# EasyEDA Pro project ran-pang-airlink-86231b34.epro, board PCB1
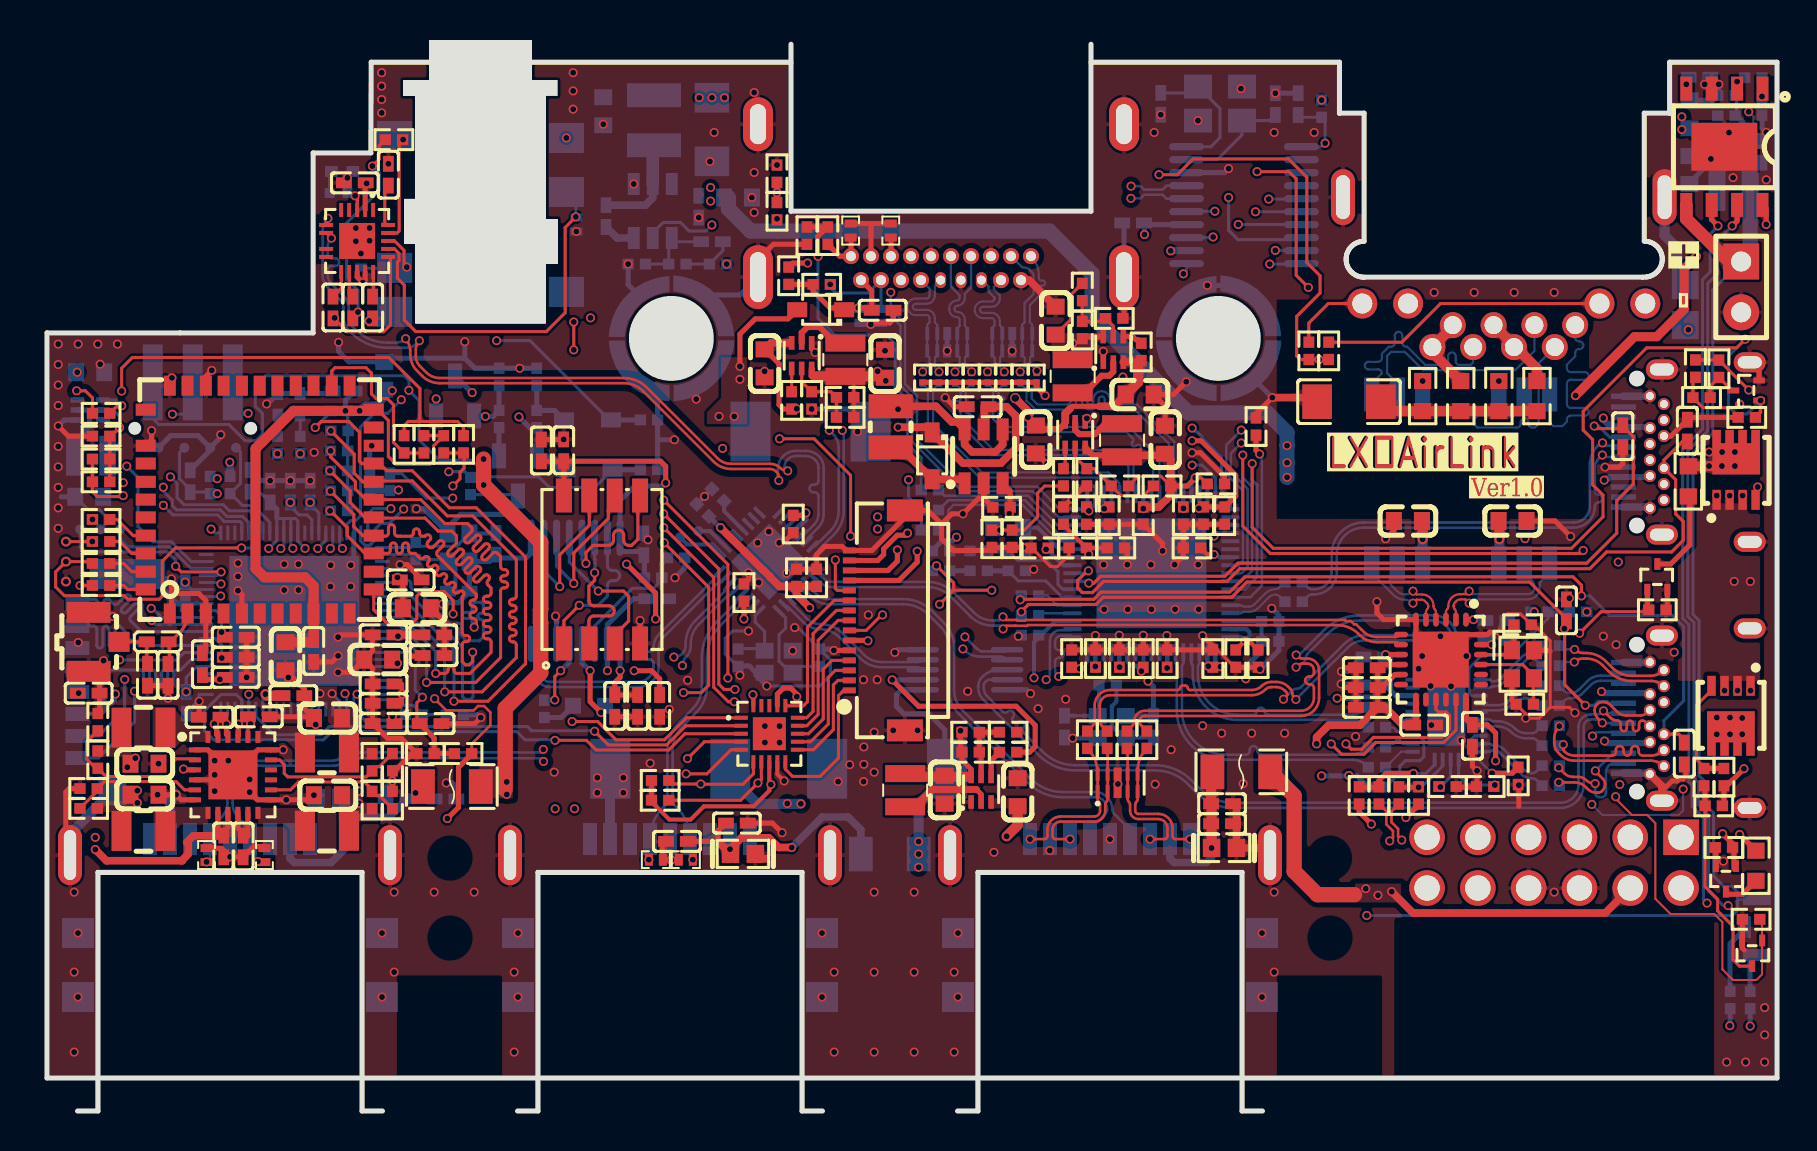
[diagram p9: board, top side]
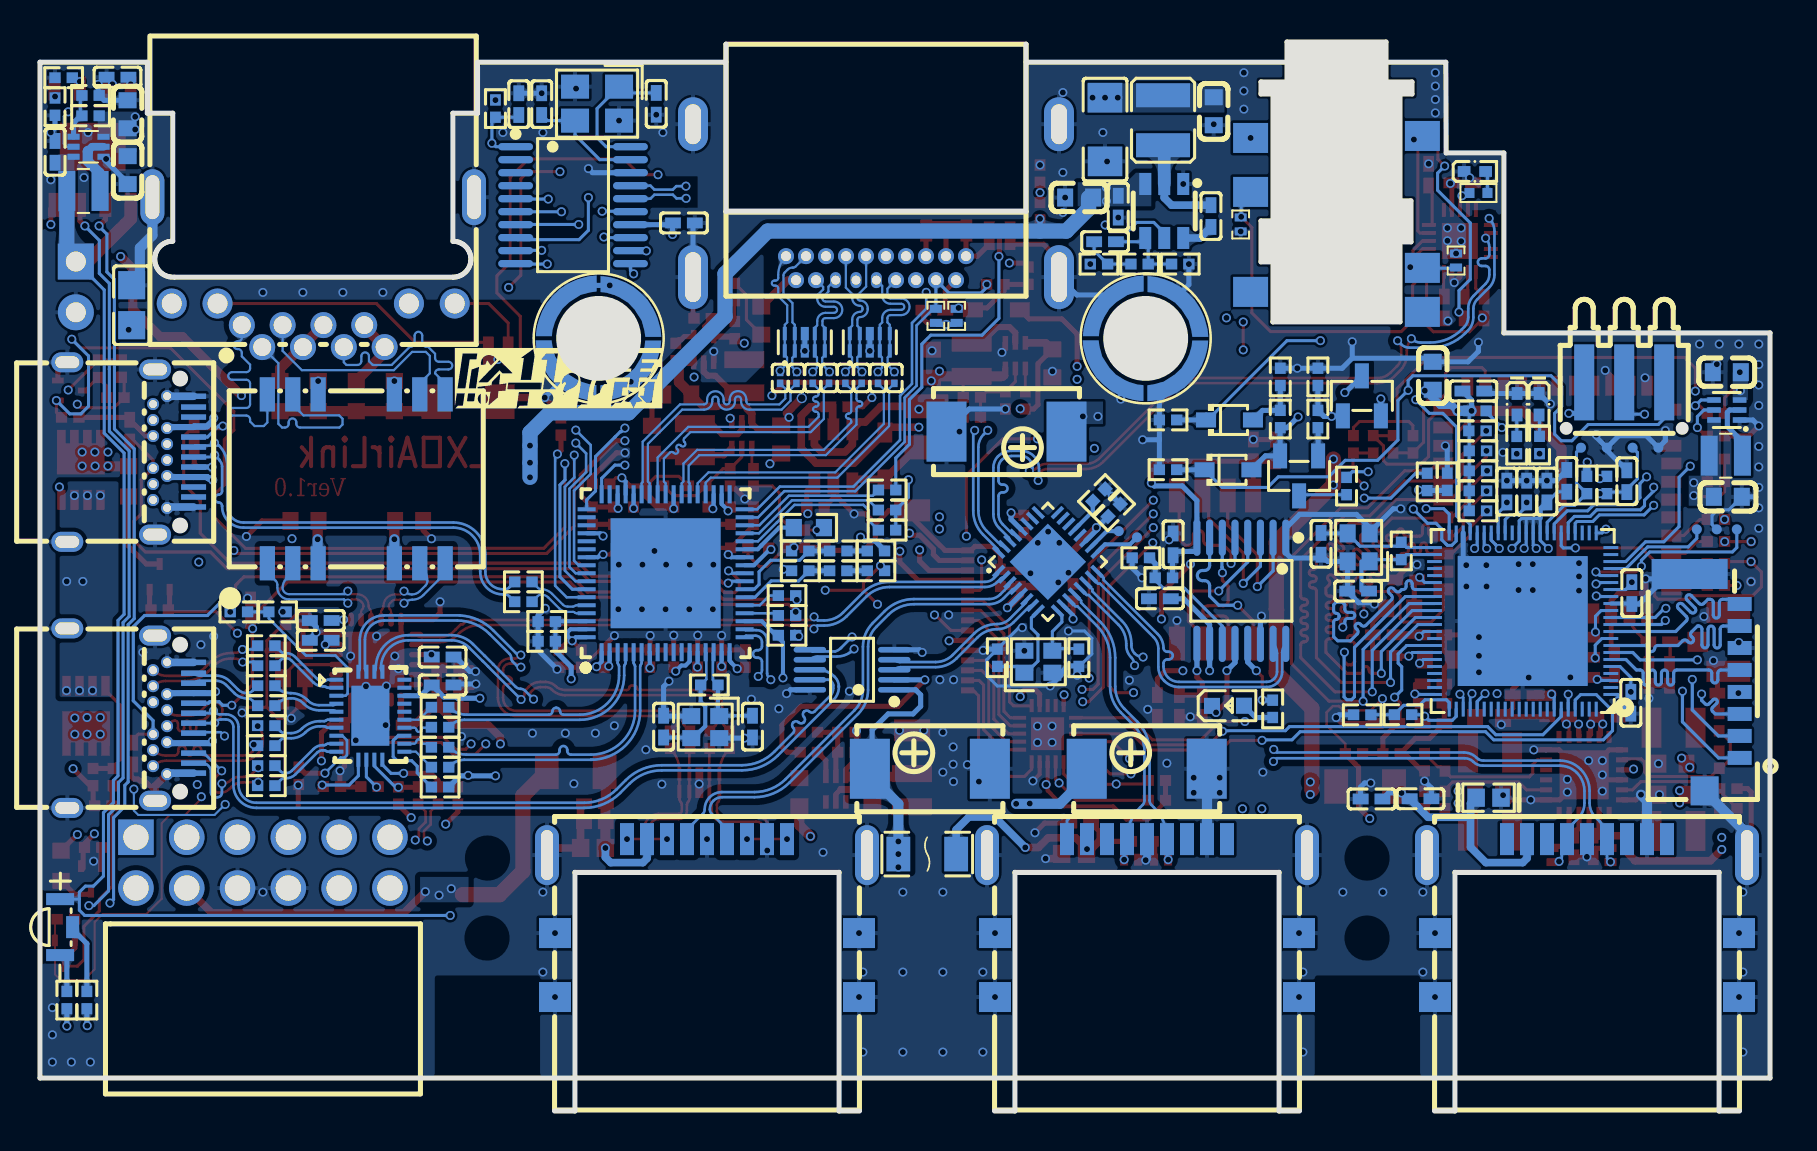
[diagram p10: board, bottom side, seen from below]

Outline 86.5 x 53.58 mm; copper layers: Top Layer, Inner2, Inner3, Inner4, Inner5, Bottom Layer. Coordinates in mm from the lower left corner of the outline.
Outline path: 37.2,52.46 16.21,52.46 16.19,47.93 13.31,47.93 13.31,38.92 0,38.92 0,1.65 86.5,1.65 86.5,52.46 81.13,52.46 81.13,49.91 ; 52.2,52.46 64.62,52.46 64.62,49.91
Stack: Top Layer 0.035mm 外层铜厚1oz / Dielectric1 0.0994mm 3313 RC57% 4.2mil / Inner2 0.0152mm 内层铜厚 / Dielectric2 0.55mm 0.55mm H/H No copper / Inner3 0.0152mm 内层铜厚 / Dielectric3 0.1088mm 2116 RC54% 4.9mil / Inner4 0.0152mm 内层铜厚 / Dielectric4 0.55mm 0.55mm H/H No copper / Inner5 0.0152mm 内层铜厚 / Dielectric5 0.0994mm 3313 RC57% 4.2mil / Bottom Layer 0.035mm 外层铜厚1oz

## Design rules (mm)
net SSTX1-: SSTX1
net SSTX1+: SSTX1
net SSTX2-: SSTX2
net SSTX2+: SSTX2
net SSTX3-: SSTX3
net SSTX3+: SSTX3
net SSTX0+: diff, SSTX0
net SSTX0-: diff, SSTX0
net SSTX4-: SSTX4
net SSTX4+: SSTX4
net HSD4-: HSD4
net HSD4+: HSD4
net AU_D-: diff, AU_D
net AU_D+: diff, AU_D
net HDMI_D2D_P: diff, HDMI_D2D_
net HDMI_D2D_N: diff, HDMI_D2D_
net HDMI_D1D_P: diff, HDMI_D1D_
net HDMI_D1D_N: diff, HDMI_D1D_
net HDMI_D0D_P: diff, HDMI_D0D_
net HDMI_D0D_N: diff, HDMI_D0D_
net HDMI_CKD_P: diff, HDMI_CKD_
net HDMI_CKD_N: diff, HDMI_CKD_
net SSRX1-: SSRX1
net SSRX1+: SSRX1
net SSRX2-: SSRX2
net SSRX2+: SSRX2
net SOC_OTG_DP: diff, SOC_OTG
net SOC_OTG_DM: diff, SOC_OTG
net HSD1+: HSD1
net HSD1-: HSD1
net USBA_D4-: USBA_D4
net USBA_D4+: USBA_D4
net SSRX0+: diff, SSRX0
net SSRX0-: diff, SSRX0
net HSD0+: diff, HSD0
net HSD0-: diff, HSD0
net EPHY_RXN: diff, EPHY_RX
net EPHY_RXP: diff, EPHY_RX
net EPHY_TXN: diff, EPHY_TX
net EPHY_TXP: diff, EPHY_TX
net SSRX4-: SSRX4
net SSRX4+: SSRX4
net SSRX3-: SSRX3
net SSRX3+: SSRX3
net HSD3-: HSD3
net HSD3+: HSD3
net HSD2-: HSD2
net HSD2+: HSD2
net HDMI-5V: diff
net C_SSRX2-: diff, C_SSRX2
net C_SSRX2+: diff, C_SSRX2
net C_SSTX2-: diff, C_SSTX2
net C_SSTX2+: diff, C_SSTX2
net C_SSTX1-: diff, C_SSTX1
net C_SSTX1+: diff, C_SSTX1
net C_SSRX1-: diff, C_SSRX1
net C_SSRX1+: diff, C_SSRX1
net DP_LANE1+: diff, DP_LANE1
net DP_LANE1-: diff, DP_LANE1
net LNB_P: diff, LNB_
net LNB_N: diff, LNB_
net DP_LANE0+: diff, DP_LANE0
net DP_LANE0-: diff, DP_LANE0
net LNA_P: diff, LNA_
net LNA_N: diff, LNA_
net UFP_AUX_N: diff, UFP_AUX_
net UFP_AUX_P: diff, UFP_AUX_
net HDMI_D2P: diff, HDMI_D2
net HDMI_D2N: diff, HDMI_D2
net HDMI_D1P: diff, HDMI_D1
net HDMI_D1N: diff, HDMI_D1
net HDMI_D0P: diff, HDMI_D0
net HDMI_D0N: diff, HDMI_D0
net HDMI_CKP: diff, HDMI_CK
net HDMI_CKN: diff, HDMI_CK
net BB_DP: diff, BB_D
net BB_DN: diff, BB_D
net USBA_D3-: diff, USBA_D3
net USBA_D3+: diff, USBA_D3
net RX2-: diff, RX2
net RX2+: diff, RX2
net TX2-: diff, TX2
net TX2+: diff, TX2
net TX1-: diff, TX1
net TX1+: diff, TX1
net RX1-: diff, RX1
net RX1+: diff, RX1
net VL822_TX1+: VL822_TX1
net VL822_TX1-: VL822_TX1
net VL822_TX2+: VL822_TX2
net VL822_TX2-: VL822_TX2
net VL822_TX3+: VL822_TX3
net VL822_TX3-: VL822_TX3
net VL822_TX4+: VL822_TX4
net VL822_TX4-: VL822_TX4
net CH347_UD-: diff, CH347_UD
net CH347_UD+: diff, CH347_UD
net MIC_N: diff
net MIC_P: diff
net MIC_M: diff
net USBA_D2+: diff, DP1
net USBA_D2-: diff, DP1
net USBA_D1+: diff, USBA_D1
net USBA_D1-: diff, USBA_D1
net DD-: DD
net DD+: DD
net DC-: DC
net DC+: DC
net DB-: diff, DB
net DB+: diff, DB
net DA-: diff, DA
net DA+: diff, DA
net TXN: diff, DP5
net TXP: diff, DP5
net RXN: diff, DP4
net RXP: diff, DP4
net NAT_D-: diff, NAT_D
net NAT_D+: diff, NAT_D
net POWUSB_DP: diff, DP6
net POWUSB_DN: diff, DP6
net SD_DM: diff, DP3
net SD_DP: diff, DP3
net HUB_D+: diff, DP2
net HUB_D-: diff, DP2
net #SSTX0+: diff, #SSTX0
net #SSTX0-: diff, #SSTX0
net #SSRX0+: diff, #SSRX0
net #SSRX0-: diff, #SSRX0
spacing copperThickness1oz (default): track to track 0.102, other pairs 0.114 to 0.3
spacing copperThickness2oz: track to track 0.203, other pairs 0.152 to 0.3
spacing safeClearance: track to track 0.089, other pairs 0.089 to 0.3
spacing Plane_innerPlane: track to track 0.102, other pairs 0.114 to 0.3
spacing Copper_copperRegion: track to track 0.102, other pairs 0.114 to 0.3
spacing Copper_DRAMCopper: track to track 0.102, other pairs 0.114 to 0.3
spacing Copper_TBCopper: track to track 0.102, other pairs 0.114 to 0.3
spacing Copper_copperRegion_POW: track to track 0.102, other pairs 0.114 to 0.3
spacing diff-to-gnd: track to track 0.152, other pairs 0.152 to 0.3
track width copperThickness1oz (default): min 0.102, default 0.254, max 2.54
track width copperThickness2oz: min 0.203, default 0.254, max 2.54
track width trackWidth: min 0.089, default 0.102, max 2.54
track width 50ohm: min 0.127, default 0.157, max 2.54
differential pair differentialPair (default): width min 0.102, default 0.254, max 2.54; gap min 0.102, default 0.102
differential pair DP100ohm: width min 0.102, default 0.109, max 2.54; gap min 0.152, default 0.152
differential pair DP90ohm: width min 0.13, default 0.13, max 0.13; gap min 0.127, default 0.127
net SSTX0+ uses DP90ohm
net SSTX0- uses DP90ohm
net AU_D- uses DP90ohm
net AU_D+ uses DP90ohm
net VIN_5V uses copperRegion_POW_copperThickness1oz
net HDMI_D2D_P uses DP100ohm
net HDMI_D2D_N uses DP100ohm
net HDMI_D1D_P uses DP100ohm
net HDMI_D1D_N uses DP100ohm
net HDMI_D0D_P uses DP100ohm
net HDMI_D0D_N uses DP100ohm
net HDMI_CKD_P uses DP100ohm
net HDMI_CKD_N uses DP100ohm
net SOC_OTG_DP uses DP90ohm
net SOC_OTG_DM uses DP90ohm
net USBA_D4- uses DP90ohm
net USBA_D4+ uses DP90ohm
net SSRX0+ uses DP90ohm
net SSRX0- uses DP90ohm
net HSD0+ uses DP90ohm
net HSD0- uses DP90ohm
net SD0_D1 uses 50ohm
net SD0_D0 uses 50ohm
net SD0_CLK uses 50ohm
net SD0_CMD uses 50ohm
net SD0_D3 uses 50ohm
net SD0_D2 uses 50ohm
net SD1_D2 uses 50ohm
net SD1_D3 uses 50ohm
net SD1_CMD uses 50ohm
net SD1_CLK uses 50ohm
net SD1_D0 uses 50ohm
net SD1_D1 uses 50ohm
net EPHY_RXN uses DP100ohm
net EPHY_RXP uses DP100ohm
net EPHY_TXN uses DP100ohm
net EPHY_TXP uses DP100ohm
net MIPI_RX4N uses DP100ohm
net MIPI_RX4P uses DP100ohm
net MIPI_RX3N uses DP100ohm
net MIPI_RX3P uses DP100ohm
net MIPI_RX2N uses DP100ohm
net MIPI_RX2P uses DP100ohm
net MIPI_RX1N uses DP100ohm
net MIPI_RX1P uses DP100ohm
net MIPI_RX0N uses DP100ohm
net MIPI_RX0P uses DP100ohm
net MIPI_TX2N uses DP100ohm
net MIPI_TX2P uses DP100ohm
net MIPI_TX1N uses DP100ohm
net MIPI_TX1P uses DP100ohm
net MIPI_TX0N uses DP100ohm
net MIPI_TX0P uses DP100ohm
net 5V-20V uses copperRegion1_copperThickness1oz
net C_SSRX2- uses DP90ohm
net C_SSRX2+ uses DP90ohm
net C_SSTX2- uses DP90ohm
net C_SSTX2+ uses DP90ohm
net C_SSTX1- uses DP90ohm
net C_SSTX1+ uses DP90ohm
net C_SSRX1- uses DP90ohm
net C_SSRX1+ uses DP90ohm
net DP_LANE1+ uses DP90ohm
net DP_LANE1- uses DP90ohm
net LNB_P uses DP100ohm
net LNB_N uses DP100ohm
net DP_LANE0+ uses DP90ohm
net DP_LANE0- uses DP90ohm
net LNA_P uses DP100ohm
net LNA_N uses DP100ohm
net UFP_AUX_N uses DP90ohm
net UFP_AUX_P uses DP90ohm
net HDMI_D2P uses DP100ohm
net HDMI_D2N uses DP100ohm
net HDMI_D1P uses DP100ohm
net HDMI_D1N uses DP100ohm
net HDMI_D0P uses DP100ohm
net HDMI_D0N uses DP100ohm
net HDMI_CKP uses DP100ohm
net HDMI_CKN uses DP100ohm
net MDI0P uses DP100ohm
net MDI0N uses DP100ohm
net MDI1P uses DP100ohm
net MDI1N uses DP100ohm
net MDI2P uses DP100ohm
net MDI2N uses DP100ohm
net MDI3P uses DP100ohm
net MDI3N uses DP100ohm
net BB_DP uses DP100ohm
net BB_DN uses DP100ohm
net USBA_D3- uses DP90ohm
net USBA_D3+ uses DP90ohm
net USB3.0_TO_USB2.0HUB_DM uses DP90ohm
net USB3.0_TO_USB2.0HUB_DP uses DP90ohm
net RX2- uses DP90ohm
net RX2+ uses DP90ohm
net TX2- uses DP90ohm
net TX2+ uses DP90ohm
net TX1- uses DP90ohm
net TX1+ uses DP90ohm
net RX1- uses DP90ohm
net RX1+ uses DP90ohm
diff pair SSTX0 uses DP90ohm
diff pair AU_D uses DP90ohm
diff pair HDMI_D2D_ uses DP100ohm
diff pair HDMI_D1D_ uses DP100ohm
diff pair HDMI_D0D_ uses DP100ohm
diff pair HDMI_CKD_ uses DP100ohm
diff pair SOC_OTG uses DP90ohm
diff pair USBA_D4 uses DP90ohm
diff pair SSRX0 uses DP90ohm
diff pair HSD0 uses DP90ohm
diff pair EPHY_RX uses DP100ohm
diff pair EPHY_TX uses DP100ohm
diff pair C_SSRX2 uses DP90ohm
diff pair C_SSTX2 uses DP90ohm
diff pair C_SSTX1 uses DP90ohm
diff pair C_SSRX1 uses DP90ohm
diff pair DP_LANE1 uses DP90ohm
diff pair LNB_ uses DP100ohm
diff pair DP_LANE0 uses DP90ohm
diff pair LNA_ uses DP100ohm
diff pair UFP_AUX_ uses DP90ohm
diff pair HDMI_D2 uses DP100ohm
diff pair HDMI_D1 uses DP100ohm
diff pair HDMI_D0 uses DP100ohm
diff pair HDMI_CK uses DP100ohm
diff pair BB_D uses DP100ohm
diff pair DP2 uses DP90ohm
diff pair USBA_D3 uses DP90ohm
diff pair DP1 uses DP90ohm
diff pair RX2 uses DP90ohm
diff pair TX2 uses DP90ohm
diff pair TX1 uses DP90ohm
diff pair RX1 uses DP90ohm
eq len grp WIFI_SDIO uses WL-SDIO
eq len grp LPDDR3_CLK_CTL_CMD uses LPDDR3_CLK_CTL_CMD
eq len grp LPDDR3_SDQ8-15 uses LPDDR3_SDQ8-15
eq len grp LPDDR3_SDQ0-7 uses LPDDR3_SDQ0-7
region e1 uses Copper_copperRegion, copperRegion_Copper_copperRegion
region e2 uses Copper_copperRegion, copperRegion_Copper_copperRegion
region e3 uses Copper_copperRegion, copperRegion_Copper_copperRegion
region e4 uses Copper_copperRegion, copperRegion_Copper_copperRegion
region e5 uses Copper_copperRegion, copperRegion_Copper_copperRegion
region e6 uses Copper_copperRegion, copperRegion_Copper_copperRegion
region e7 uses Copper_copperRegion, copperRegion_Copper_copperRegion
region e8 uses Copper_copperRegion, copperRegion_Copper_copperRegion
region e9 uses Copper_copperRegion, copperRegion_Copper_copperRegion
region e10 uses Copper_copperRegion, copperRegion_Copper_copperRegion
region e11 uses Copper_copperRegion, copperRegion_Copper_copperRegion
region e12 uses Copper_copperRegion, copperRegion_Copper_copperRegion
region e13 uses Copper_copperRegion, copperRegion_Copper_copperRegion
region e14 uses Copper_copperRegion, copperRegion_Copper_copperRegion
region e15 uses Copper_copperRegion, copperRegion_Copper_copperRegion
region e16 uses Copper_copperRegion, copperRegion_Copper_copperRegion
region e17 uses Copper_copperRegion, copperRegion_Copper_copperRegion
region e18 uses Copper_copperRegion, copperRegion_Copper_copperRegion
region e19 uses Copper_copperRegion, copperRegion_Copper_copperRegion
region e20 uses Copper_copperRegion, copperRegion_Copper_copperRegion
region e21 uses Copper_copperRegion, copperRegion_Copper_copperRegion
region e22 uses Copper_copperRegion, copperRegion_Copper_copperRegion
region e23 uses Copper_copperRegion, copperRegion_Copper_copperRegion
region e24 uses Copper_copperRegion, copperRegion_Copper_copperRegion
region e25 uses Copper_copperRegion, copperRegion_Copper_copperRegion
region e26 uses Copper_copperRegion, copperRegion_Copper_copperRegion
region e27 uses Copper_copperRegion, copperRegion_Copper_copperRegion
region e28 uses Copper_copperRegion, copperRegion_Copper_copperRegion
region e29 uses Copper_copperRegion, copperRegion_Copper_copperRegion
region e30 uses Copper_copperRegion, copperRegion_Copper_copperRegion
region e31 uses Copper_copperRegion, copperRegion_Copper_copperRegion
region e32 uses Copper_copperRegion, copperRegion_Copper_copperRegion
region e33 uses Copper_copperRegion, copperRegion_Copper_copperRegion
region e34 uses Copper_copperRegion, copperRegion_Copper_copperRegion
region e35 uses Copper_copperRegion, copperRegion_Copper_copperRegion
region e36 uses Copper_copperRegion, copperRegion_Copper_copperRegion
region e37 uses Copper_copperRegion, copperRegion_Copper_copperRegion
region e38 uses Copper_copperRegion, copperRegion_Copper_copperRegion
region e39 uses Copper_copperRegion, copperRegion_Copper_copperRegion
region e40 uses Copper_copperRegion, copperRegion_Copper_copperRegion
region e41 uses Copper_copperRegion, copperRegion_Copper_copperRegion
region e42 uses Copper_copperRegion, copperRegion_Copper_copperRegion
region e43 uses Copper_copperRegion, copperRegion_Copper_copperRegion
region e44 uses Copper_copperRegion, copperRegion_Copper_copperRegion
region e45 uses Copper_copperRegion, copperRegion_Copper_copperRegion
region e46 uses Copper_copperRegion, copperRegion_Copper_copperRegion
region e47 uses Copper_copperRegion, copperRegion_Copper_copperRegion
region e48 uses Copper_copperRegion, copperRegion_Copper_copperRegion
region e49 uses Copper_copperRegion, copperRegion_Copper_copperRegion
region e50 uses Copper_copperRegion, copperRegion_Copper_copperRegion
region e51 uses Copper_copperRegion, copperRegion_Copper_copperRegion
region e52 uses Copper_copperRegion, copperRegion_Copper_copperRegion
region e53 uses Copper_copperRegion, copperRegion_Copper_copperRegion
region e54 uses Copper_copperRegion, copperRegion_Copper_copperRegion
region e55 uses Copper_copperRegion, copperRegion_Copper_copperRegion
region e56 uses Copper_copperRegion, copperRegion_Copper_copperRegion
region e57 uses Copper_copperRegion, copperRegion_Copper_copperRegion
region e58 uses Copper_copperRegion, copperRegion_Copper_copperRegion
region e59 uses Copper_copperRegion, copperRegion_Copper_copperRegion
region e60 uses Copper_copperRegion, copperRegion_Copper_copperRegion
region e61 uses Copper_copperRegion, copperRegion_Copper_copperRegion
region e62 uses Copper_copperRegion, copperRegion_Copper_copperRegion
region e63 uses Copper_copperRegion, copperRegion_Copper_copperRegion
region e64 uses Copper_copperRegion, copperRegion_Copper_copperRegion
region e65 uses Copper_copperRegion, copperRegion_Copper_copperRegion
region e66 uses Copper_copperRegion, copperRegion_Copper_copperRegion
region e67 uses Copper_copperRegion, copperRegion_Copper_copperRegion
region e68 uses Copper_copperRegion, copperRegion_Copper_copperRegion
region e69 uses Copper_copperRegion, copperRegion_Copper_copperRegion
region e70 uses Copper_copperRegion, copperRegion_Copper_copperRegion
region e71 uses Copper_copperRegion, copperRegion_Copper_copperRegion
region e72 uses Copper_copperRegion, copperRegion_Copper_copperRegion
region e73 uses Copper_copperRegion, copperRegion_Copper_copperRegion
region e74 uses Copper_copperRegion, copperRegion_Copper_copperRegion
region e75 uses Copper_copperRegion, copperRegion_Copper_copperRegion
region e76 uses Copper_copperRegion, copperRegion_Copper_copperRegion
region e77 uses Copper_copperRegion, copperRegion_Copper_copperRegion
region e78 uses Copper_copperRegion, copperRegion_Copper_copperRegion
region e79 uses Copper_copperRegion, copperRegion_Copper_copperRegion
region e80 uses Copper_copperRegion, copperRegion_Copper_copperRegion
region e81 uses Copper_copperRegion, copperRegion_Copper_copperRegion
region e82 uses Copper_copperRegion, copperRegion_Copper_copperRegion
region e83 uses Copper_copperRegion, copperRegion_Copper_copperRegion
region e84 uses Copper_copperRegion, copperRegion_Copper_copperRegion
region e85 uses Copper_copperRegion, copperRegion_Copper_copperRegion
region e86 uses Copper_copperRegion, copperRegion_Copper_copperRegion
region e87 uses Copper_copperRegion, copperRegion_Copper_copperRegion
region e88 uses Copper_copperRegion, copperRegion_Copper_copperRegion
region e89 uses Copper_copperRegion, copperRegion_Copper_copperRegion
region e90 uses Copper_copperRegion, copperRegion_Copper_copperRegion
region e91 uses Copper_copperRegion, copperRegion_Copper_copperRegion
region e92 uses Copper_copperRegion, copperRegion_Copper_copperRegion
region e93 uses Copper_copperRegion, copperRegion_Copper_copperRegion
region e94 uses Copper_copperRegion, copperRegion_Copper_copperRegion
region e95 uses Copper_copperRegion, copperRegion_Copper_copperRegion
region e96 uses Copper_copperRegion, copperRegion_Copper_copperRegion
region e97 uses Copper_copperRegion, copperRegion_Copper_copperRegion
region e98 uses Copper_copperRegion, copperRegion_Copper_copperRegion
region e100 uses Copper_copperRegion, copperRegion_Copper_copperRegion
region e101 uses Copper_copperRegion, copperRegion_Copper_copperRegion
region e102 uses Copper_copperRegion, copperRegion_Copper_copperRegion
region e103 uses Copper_copperRegion, copperRegion_Copper_copperRegion
region e104 uses Copper_copperRegion, copperRegion_Copper_copperRegion
region e105 uses Copper_copperRegion, copperRegion_Copper_copperRegion
region e106 uses Copper_copperRegion, copperRegion_Copper_copperRegion
region e107 uses Copper_copperRegion, copperRegion_Copper_copperRegion
region e108 uses Copper_copperRegion, copperRegion_Copper_copperRegion
region e109 uses Copper_copperRegion, copperRegion_Copper_copperRegion
region e110 uses Copper_copperRegion, copperRegion_Copper_copperRegion
region e111 uses Copper_copperRegion, copperRegion_Copper_copperRegion
region e112 uses Copper_copperRegion, copperRegion_Copper_copperRegion
region e113 uses Copper_copperRegion, copperRegion_Copper_copperRegion
region e114 uses Copper_copperRegion, copperRegion_Copper_copperRegion
region e115 uses Copper_copperRegion, copperRegion_Copper_copperRegion
region e116 uses Copper_copperRegion, copperRegion_Copper_copperRegion
region e117 uses Copper_copperRegion, copperRegion_Copper_copperRegion
region e118 uses Copper_copperRegion, copperRegion_Copper_copperRegion
region e119 uses Copper_copperRegion, copperRegion_Copper_copperRegion
region e120 uses Copper_copperRegion, copperRegion_Copper_copperRegion
region e121 uses Copper_copperRegion, copperRegion_Copper_copperRegion
region e122 uses Copper_copperRegion, copperRegion_Copper_copperRegion
region e123 uses Copper_copperRegion, copperRegion_Copper_copperRegion
region e124 uses Copper_copperRegion, copperRegion_Copper_copperRegion
region e125 uses Copper_copperRegion, copperRegion_Copper_copperRegion
region e126 uses Copper_copperRegion, copperRegion_Copper_copperRegion
region e127 uses Copper_copperRegion, copperRegion_Copper_copperRegion
region e128 uses Copper_copperRegion, copperRegion_Copper_copperRegion
region e129 uses Copper_copperRegion, copperRegion_Copper_copperRegion
region e130 uses Copper_copperRegion, copperRegion_Copper_copperRegion
region e131 uses Copper_copperRegion, copperRegion_Copper_copperRegion
region e132 uses Copper_copperRegion, copperRegion_Copper_copperRegion
region e133 uses Copper_copperRegion, copperRegion_Copper_copperRegion
region e134 uses Copper_copperRegion, copperRegion_Copper_copperRegion
region e135 uses Copper_copperRegion, copperRegion_Copper_copperRegion
region e136 uses Copper_copperRegion, copperRegion_Copper_copperRegion
region e137 uses Copper_copperRegion, copperRegion_Copper_copperRegion
region e138 uses Copper_copperRegion, copperRegion_Copper_copperRegion
region e139 uses Copper_copperRegion, copperRegion_Copper_copperRegion
region e140 uses Copper_copperRegion, copperRegion_Copper_copperRegion
region e141 uses Copper_copperRegion, copperRegion_Copper_copperRegion
region e142 uses Copper_copperRegion, copperRegion_Copper_copperRegion
region e143 uses Copper_copperRegion, copperRegion_Copper_copperRegion
region e144 uses Copper_copperRegion, copperRegion_Copper_copperRegion
region e145 uses Copper_copperRegion, copperRegion_Copper_copperRegion
region e146 uses Copper_copperRegion, copperRegion_Copper_copperRegion
region e147 uses Copper_copperRegion, copperRegion_Copper_copperRegion
region e148 uses Copper_copperRegion, copperRegion_Copper_copperRegion
region e149 uses Copper_copperRegion, copperRegion_Copper_copperRegion
region e150 uses Copper_copperRegion, copperRegion_Copper_copperRegion
region e151 uses Copper_copperRegion, copperRegion_Copper_copperRegion
region e152 uses Copper_copperRegion, copperRegion_Copper_copperRegion
region e153 uses Copper_copperRegion, copperRegion_Copper_copperRegion
region e154 uses Copper_copperRegion, copperRegion_Copper_copperRegion
region e155 uses Copper_copperRegion, copperRegion_Copper_copperRegion
region e156 uses Copper_copperRegion, copperRegion_Copper_copperRegion
region e157 uses Copper_copperRegion, copperRegion_Copper_copperRegion
region e158 uses Copper_copperRegion, copperRegion_Copper_copperRegion
region e159 uses Copper_copperRegion, copperRegion_Copper_copperRegion
region e160 uses Copper_copperRegion, copperRegion_Copper_copperRegion
region e161 uses Copper_copperRegion, copperRegion_Copper_copperRegion
region e162 uses Copper_copperRegion, copperRegion_Copper_copperRegion
region e163 uses Copper_copperRegion, copperRegion_Copper_copperRegion
region e164 uses Copper_copperRegion, copperRegion_Copper_copperRegion
region e165 uses Copper_copperRegion, copperRegion_Copper_copperRegion
region e166 uses Copper_copperRegion, copperRegion_Copper_copperRegion
region e167 uses Copper_copperRegion, copperRegion_Copper_copperRegion
region e168 uses Copper_copperRegion, copperRegion_Copper_copperRegion
region e169 uses Copper_copperRegion, copperRegion_Copper_copperRegion
region e170 uses Copper_copperRegion, copperRegion_Copper_copperRegion
net VBAT uses copperRegion1_copperThickness1oz
net SOC_DEBUG_DP uses DP90ohm
net SOC_DEBUG_DM uses DP90ohm
net CH347_UD- uses DP90ohm
net CH347_UD+ uses DP90ohm
net VBAT_5V uses Plane_innerPlane, copperRegion_Plane_innerPlane, innerPlane1
net NAT_SSTXN uses DP90ohm
net NAT_SSTXP uses DP90ohm
pour e2214 uses copperRegion_POW_default, default
pour e2220 uses copperRegion1_default, default
pour e2222 uses Copper_copperRegion_POW, copperRegion_Copper_copperRegion_POW
pour e2230 uses Copper_copperRegion_POW, copperRegion_Copper_copperRegion_POW
pour e2232 uses copperRegion1_default, default
pour e2234 uses copperRegion1_default, default
net DB- uses DP100ohm
net DB+ uses DP100ohm
net DA- uses DP100ohm
net DA+ uses DP100ohm
diff pair CH347_UD uses DP90ohm
diff pair DB uses DP100ohm
diff pair DA uses DP100ohm
net HUB_D- uses DP90ohm
net HUB_D+ uses DP90ohm
net NAT_D- uses DP90ohm
net NAT_D+ uses DP90ohm
net POWUSB_DN uses DP90ohm
net POWUSB_DP uses DP90ohm
net RXN uses DP100ohm
net RXP uses DP100ohm
net SD_DM uses DP90ohm
net SD_DP uses DP90ohm
net TXN uses DP100ohm
net TXP uses DP100ohm
net USBA_D1- uses DP90ohm
net USBA_D1+ uses DP90ohm
net USBA_D2- uses DP90ohm
net USBA_D2+ uses DP90ohm
diff pair NAT_D uses DP90ohm
diff pair USBA_D1 uses DP90ohm
diff pair DP3 uses DP90ohm
diff pair DP4 uses DP100ohm
diff pair DP5 uses DP100ohm
diff pair DP6 uses DP90ohm
pour e6334 uses Copper_copperRegion, copperRegion_Copper_copperRegion
pour e6754 uses Copper_copperRegion, copperRegion_Copper_copperRegion
pour e7233 uses Copper_copperRegion, copperRegion_Copper_copperRegion
pour e7334 uses Copper_copperRegion, copperRegion_Copper_copperRegion
net #SSRX0- uses DP90ohm
net #SSRX0+ uses DP90ohm
net #SSTX0- uses DP90ohm
net #SSTX0+ uses DP90ohm
diff pair #SSRX0 uses DP90ohm
diff pair #SSTX0 uses DP90ohm
['net class', 'diff'] ['NET', 'GND'] uses diff-to-gnd

## Placement (name value [footprint] x y rotation side)
BAT1  -  [HDR-TH_2P-P2.54-V-M-1]  84.71 41.22 270 top
C1  2.2uF  [C0402]  9.44 23.7 180 top
C2  2.2uF  [C0402]  16.83 23.82 0 top
C3  100nF  [C0402]  19.32 23.81 180 top
C4  100nF  [C0402]  16.83 20.4 0 top
C5  100nF  [C0402]  16.83 21.36 0 top
C6  2.2uF  [C0402]  10.16 31.52 270 bottom
C7  100nF  [C0402]  11.16 30.99 270 bottom
C8  100nF  [C0402]  13.16 30.99 270 bottom
C9  2.2uF  [C0402]  9.44 21.69 180 top
C10  100nF  [C0402]  7.77 22.35 270 top
C11  2.2uF  [C0402]  6.96 20.42 90 bottom
C12  100nF  [C0402]  12.32 20.78 180 top
C13  100nF  [C0402]  12.17 30.99 270 bottom
C14  100nF  [C0402]  19.33 22.78 180 top
C15  22uF  [C0603]  18.49 25.15 180 top
C16  10uF  [C0603]  16.56 22.58 0 top
C17  2.2uF  [C0402]  9.44 22.7 180 top
C18  2.2uF  [C0402]  6.91 25.91 90 bottom
C19  2.2uF  [C0402]  18.19 26.57 180 top
C20  100nF  [C0402]  7.16 31.51 270 bottom
C21  100nF  [C0402]  58.75 14.37 180 top
C22  100nF  [C0402]  66.37 22.71 0 bottom
C23  22uF  [C0603]  14.05 15.8 0 top
C25  22uF  [C0603]  4.88 15.82 180 top
C26  22uF  [C0603]  44.88 16.07 90 top
C27  100nF  [R0402]  54.99 18.57 270 top
C28  100nF  [R0402]  54 18.57 270 top
C29  22uF  [C0603]  48.53 15.95 270 top
C30  47pF  [R0402]  46.18 17.95 0 top
C31  22uF  [C0603]  4.88 17.37 180 top
C33  10uF  [C0402]  30.63 20.27 90 top
C34  100nF  [C0402]  30.51 25.62 180 bottom
C39  10uF  [C0603]  11.93 22.75 90 top
C40  100nF  [C0402]  13.33 23.01 90 top
C102  22uF  [C0603]  35.88 37.4 90 top
C104  22uF  [C0603]  41.9 37.38 270 top
C107  47pF  [R0402]  39.91 34.7 180 top
C122  4.7uF  [R0402]  58.88 29.78 270 top
C123  100nF  [R0402]  57.83 29.78 270 top
C129  100nF  [R0402]  53.62 22.63 90 top
C130  100nF  [R0402]  58.44 31.37 0 top
C131  100nF  [R0402]  58.29 22.63 90 top
C132  100nF  [R0402]  52.43 22.63 90 top
C135  4.7uF  [R0402]  59.44 22.63 270 top
C136  100nF  [R0402]  54.81 22.63 90 top
C137  4.7uF  [R0402]  61.16 24.49 0 bottom
C138  100nF  [R0402]  49.15 23.8 180 bottom
C139  100nF  [R0402]  61.16 23.5 0 bottom
C140  100nF  [R0402]  56.82 29.78 270 top
C141  100nF  [R0402]  51.23 22.63 90 top
C143  4.7uF  [R0402]  47.24 28.63 270 top
C144  100nF  [R0402]  48.26 28.63 270 top
C145  4.7uF  [R0402]  53.44 28.17 0 top
C146  100nF  [R0402]  51.54 28.17 180 top
C148  22uF  [C0603]  49.44 33.59 90 top
C149  22uF  [C0603]  55.91 33.58 270 top
C157  10uF  [C0402]  41.78 40.06 180 top
C160  100nF  [C0402]  2.08 20.9 180 top
C162  100nF  [R0402]  60.55 22.63 270 top
C163  100nF  [R0402]  56.01 22.63 90 top
C164  100nF  [R0402]  57.25 28.17 180 top
C168  2.2uF  [R0402]  83.84 16.7 270 top
C169  2.2uF  [R0402]  82.42 37.14 90 top
C243  100nF  [C0402]  62.56 50.37 270 bottom
C244  100nF  [C0402]  54.3 44.43 180 bottom
C287  100nF  [R0402]  75.19 16.27 180 bottom
C288  100nF  [R0402]  75.19 17.28 180 bottom
C289  100nF  [R0402]  75.19 18.28 180 bottom
C290  100nF  [R0402]  75.19 19.28 180 bottom
C291  100nF  [R0402]  75.19 20.28 180 bottom
C292  100nF  [R0402]  75.19 21.28 180 bottom
C293  100nF  [R0402]  75.19 22.28 180 bottom
C294  100nF  [R0402]  75.19 23.28 180 bottom
C295  100nF  [R0402]  66.5 18.2 180 bottom
C296  100nF  [R0402]  66.5 17.2 180 bottom
C297  100nF  [R0402]  66.5 20.2 180 bottom
C298  100nF  [R0402]  66.5 19.2 180 bottom
C332  100nF  [R0402]  54.81 29.78 270 top
C333  100nF  [R0402]  51.97 29.78 270 top
C334  100nF  [R0402]  49.63 28.17 180 top
C335  100nF  [R0402]  53.11 29.78 270 top
C336  12pF  [C0402]  50.88 19.23 90 bottom
C337  12pF  [C0402]  55.32 19.23 270 bottom
C377  10uF  [C0402]  46.53 35.23 180 top
C387  22uF  [C0805]  81.91 40.31 270 bottom
C388  560pF  [C0402]  78.79 33.76 90 top
C389  560pF  [C0402]  82.02 34.04 270 top
C420  560pF  [C0402]  75.97 25.05 90 top
C421  560pF  [C0402]  81.86 17.88 270 top
C422  100nF  [C0402]  66.37 21.31 180 bottom
C425  100nF  [R0402]  67.59 15.79 90 top
C426  100nF  [R0402]  66.6 15.79 90 top
C427  220nF  [C0201]  49.5 36.67 90 bottom
C428  220nF  [C0201]  48.68 36.67 90 bottom
C429  220nF  [C0201]  47.86 36.67 90 bottom
C430  220nF  [C0201]  47.05 36.67 90 bottom
C431  220nF  [C0201]  46.23 36.67 90 bottom
C432  220nF  [C0201]  45.42 36.67 90 bottom
C433  220nF  [C0201]  44.6 36.67 90 bottom
C434  220nF  [C0201]  43.78 36.67 90 bottom
C437  10pF  [C0402]  61.42 50.37 90 bottom
C438  10pF  [C0402]  55.69 50.38 270 bottom
C444  1uF  [C0402]  10.59 19.72 180 top
C445  1uF  [C0402]  8.13 19.7 0 top
C447  22uF  [C0603]  14.05 19.66 0 top
C489  1uF  [C0402]  82.63 51.72 180 bottom
C490  10uF  [C0402]  85.75 47.98 270 bottom
C492  22uF  [C0603]  82.12 49.86 270 bottom
C493  22uF  [C0603]  82.12 47.07 90 bottom
C496  100nF  [C0402]  27.95 44.77 90 bottom
C497  10uF  [C0603]  34.54 45.7 180 bottom
C499  100nF  [C0402]  32.59 45.24 90 bottom
C502  22uF  [C0603]  27.81 50.01 90 bottom
C503  10pF  [C0402]  33.25 43.49 180 bottom
C509  12pF  [C0402]  22.45 28.37 90 bottom
C510  12pF  [C0402]  20.59 26.01 180 bottom
C511  NC  [C0402]  5.03 21.82 90 top
C512  NC  [C0402]  6.05 21.82 90 top
C516  22uF  [C0603]  2.11 30.73 0 bottom
C517  22uF  [C0603]  2.16 36.96 180 bottom
C518  47pF  [R0402]  2.71 32.61 0 top
C520  22uF  [C0603]  50.43 39.54 270 top
C521  22uF  [C0603]  54.63 35.84 180 top
C522  47pF  [R0402]  51.76 40.97 270 top
C523  100nF  [C0402]  19.18 19.38 180 top
C524  100uF  [C1206]  33.25 49.1 90 bottom
C525  100nF  [C0402]  14.83 36.02 0 bottom
C526  10uF  [C0603]  16.86 36.78 270 bottom
C527  100nF  [C0402]  16.83 19.38 0 top
C528  1uF  [C0402]  15.39 46.43 0 top
C529  1uF  [C0402]  16.28 40.19 90 top
C530  1uF  [C0402]  17.07 46.84 270 top
C531  1uF  [C0402]  15.29 40.19 90 top
C532  1uF  [C0402]  14.3 40.19 90 top
C533  22uF  [C0402]  8.84 13.23 90 top
C534  22uF  [C0402]  9.8 13.23 90 top
C535  10uF  [C0402]  34.49 14.4 180 top
C536  100nF  [C0402]  31.5 13.49 0 top
C537  10uF  [C0402]  19.92 15.61 180 bottom
C538  100nF  [C0402]  17.47 15.62 0 bottom
C539  10uF  [C0402]  58.75 15.37 180 top
C540  100nF  [C0402]  72.47 24.54 180 bottom
C541  10uF  [C0402]  65.99 20.19 0 top
C542  100nF  [C0402]  65.99 22.17 0 top
C543  100nF  [C0402]  65.99 21.18 0 top
C544  100nF  [C0402]  68.86 19.3 180 top
C545  12pF  [R0402]  73.89 20.35 0 top
C546  12pF  [R0402]  73.78 24.32 0 top
C547  1uF  [C0402]  72.47 23.55 0 bottom
C549  1nF  [C1206]  65.1 35.48 0 top
C550  1uF  [C0603_1]  68.05 29.52 180 top
C551  1uF  [C0603_1]  73.28 29.52 0 top
C552  100nF  [C0402_1]  29.84 28.35 270 bottom
C553  100nF  [C0402_1]  28.39 20.27 90 top
C554  100nF  [C0402_1]  24.72 33.04 270 top
C555  100nF  [C0402_1]  25.83 33.05 270 top
C556  2.2uF  [C0402_1]  29.53 20.27 270 top
C557  1uF  [R0402]  37.48 26.67 90 top
C558  100nF  [R0402]  38.48 26.67 90 top
C559  12pF  [R0402]  38.63 22.67 270 bottom
C561  1uF  [R0402]  34.85 25.93 90 top
C562  1uF  [R0402]  32.79 30.05 135 bottom
C563  100nF  [R0402]  37.31 29.36 90 top
C564  100nF  [C0402]  71.27 18.77 90 top
C565  220uF  [CAP-SMD_L7.3-W4.3-RD_177EC0013]  42.01 17.12 0 bottom
C566  220uF  [CAP-SMD_L7.3-W4.3-RD_177EC0013]  31.16 17.12 0 bottom
C567  220uF  [CAP-SMD_L7.3-W4.3-RD_177EC0013]  38.18 33.99 180 bottom
CARD2  TF-021B-H265  [TF-SMD_TF-021B-H265]  2.77 21.44 270 bottom
CN2  PJ-342D  [AUDIO-SMD_PJ-342D]  21.68 44.38 270 bottom
D2  AZ1045-04F.R7G  [DFN2510-10_L2.5-W1.0-P0.50-BL]  48.26 38.46 180 bottom
D3  AZ1045-04F.R7G  [DFN2510-10_L2.5-W1.0-P0.50-BL]  45.01 38.46 180 bottom
D7  1N5819WS  [SOD-323_L1.8-W1.3-LS2.5-RD]  38.68 40.08 180 top
D14  AZ1045-04F.R7G  [DFN2510-10_L2.5-W1.0-P0.50-BL]  53.53 16.42 0 top
D15  PGB1010603MR  [D0603-BI]  34.8 12.86 180 top
D16  PGB1010603MR  [D0603-BI]  58.85 13.16 180 top
D24  1N5819WS  [SOD-323_L1.8-W1.3-LS2.5-RD]  44.26 32.77 270 top
D28  PGB1010603MR  [D0603-BI]  14.07 15.67 0 bottom
D30  1N4148WS  [SOD-323_L1.8-W1.3-LS2.5-RD]  27.1 32.08 180 bottom
D31  1N4148WS  [SOD-323_L1.8-W1.3-LS2.5-RD]  27.03 34.57 180 bottom
F1  SMD1206-100-24  [F1206]  42.14 12.85 180 bottom
F2  SMD1206-100-24  [F1206]  20.24 16.23 180 top
F3  SMD1206-100-24  [F1206]  59.72 16.97 180 top
FPC1  GT-F0509SR15-15SMT01  [CONN-SMD_GT-F0509SR15-15SMT01]  41.51 24.54 90 top
H5  A2541HWR-2x6P  [HDR-TH_12P-P2.54-H-F-R2-C6-S2.54-W10.2]  75.35 12.42 180 bottom
JP3  U.FL-R-SMT-1(80)  [RF-SMD_FRF05002-JSS103M]  2.84 23.47 90 top
L1  1uH  [IND-SMD_L2.5-W2.0-VLS252012CX-150M]  42.91 16.05 90 top
L4  10uH  [IND-SMD_L2.5-W2.0]  42.18 34.22 270 top
L5  3nH  [L0402]  5.54 23.47 0 top
L6  1uH  [IND-SMD_L2.5-W2.0-VLS252012CX-150M]  39.92 37.58 270 top
L9  1uH  [IND-SMD_L2.5-W2.0-VLS252012CX-150M]  53.75 33.55 270 top
L25  1.5uH  [IND-SMD_L2.5-W2.0_YXMBL252010P]  14 14.02 0 top
L26  1.5uH  [IND-SMD_L2.5-W2.0_YXMBL252010P]  4.83 14.01 180 top
L27  1.5uH  [IND-SMD_L2.5-W2.0_YXMBL252010P]  4.83 19.18 180 top
L28  1.5uH  [IND-SMD_L2.5-W2.0_YXMBL252010P]  14 17.93 0 top
L30  1uH  [IND-SMD_L2.5-W2.0-VLS252012CX-150M]  84.33 46.03 180 bottom
L32  1uH  [IND-SMD_L2.5-W2.0-VLS252012CX-150M]  2.21 32.78 0 bottom
L33  1uH  [IND-SMD_L2.5-W2.0-VLS252012CX-150M]  51.28 36.75 90 top
L34  10uH  [IND-SMD_L3.2-W2.5_CKST322512-2.2UH]  30.35 49.56 270 bottom
L35  350uH  [XFMR-SMD_12P-P1.27_HX0068ANLTP]  70.69 31.62 180 bottom
LED1  -  [LED_0402]  11.55 35.36 270 bottom
LED2  -  [LED_0402]  12.65 35.36 270 bottom
LED4  NCD3010RG1  [LED-SMD_NCD3010RG1]  85.18 9.2 90 bottom
LED12  XL-1005BGWC  [LED0402]  14.76 47 180 bottom
M2  CJAB35P03  [POWERDI3333-8_DMN7022LFGQ-7]  84.45 31.6 0 top
M3  CJAB35P03  [POWERDI3333-8_DMN7022LFGQ-7]  84.2 20.24 180 top
M4  2N7002T  [SC-75-3_L1.6-W0.8-P1.00-LS1.7-BR]  80.52 26.72 270 top
M5  2N7002T  [SC-75-3_L1.6-W0.8-P1.00-LS1.7-BR]  85.26 7.89 90 top
M6  2N7002T  [SC-75-3_L1.6-W0.8-P1.00-LS1.7-BR]  84.96 36.04 0 top
M7  2N7002T  [SC-75-3_L1.6-W0.8-P1.00-LS1.7-BR]  83.95 11.61 90 top
Q1  AO3400A  [SOT-23-3_L2.9-W1.3-P1.90-LS2.4-BR]  23.54 31.77 90 bottom
Q2  AO3400A  [SOT-23-3_L2.9-W1.3-P1.90-LS2.4-BR]  20.41 35.77 270 bottom
R1  10K  [R0402]  18.35 19.83 0 bottom
R2  NC  [R0402]  20.39 19.82 0 bottom
R3  26.1K  [R0402]  17.14 31.47 270 bottom
R4  43K  [R0402]  16.14 31.48 90 bottom
R5  10K  [R0402]  11.52 33.32 90 bottom
R6  5.1K  [R0402]  12.66 33.31 90 bottom
R7  10K  [R0402]  9.16 31.31 270 bottom
R8  10K  [R0402]  8.16 31.31 270 bottom
R9  20kΩ  [R0402]  53.64 31.27 0 top
R10  68K  [R0402]  16.26 15.56 270 top
R11  15kΩ  [R0402]  46.18 18.95 0 top
R12  3.32kΩ  [R0402]  48.06 18.95 180 top
R13  100kΩ  [R0402]  48.06 17.95 180 top
R14  0R  [R0402]  85.75 50.24 90 bottom
R15  0R  [R0402]  53.01 18.57 270 top
R16  33K  [R0402]  2.54 19.45 90 top
R17  20K  [R0402]  17.27 17.45 270 top
R19  0R  [R0402]  52.02 18.57 270 top
R20  1K  [R0402]  85.16 5.55 90 bottom
R25  10kΩ  [R0402]  66.5 16.21 0 bottom
R26  10kΩ  [R0402]  73.56 16.76 90 top
R27  2K  [R0402]  85.32 51.69 0 bottom
R28  10kΩ  [R0402]  74.62 24.97 180 bottom
R29  2MΩ  [R0402]  71.91 16.23 180 top
R30  2MΩ  [R0402]  70.03 16.23 0 top
R31  1K  [R0402]  84.16 5.55 90 bottom
R32  33K  [R0402]  14.6 30.02 180 bottom
R33  4.7M  [R0402]  34.56 22.67 90 bottom
R34  NC  [R0402]  2.71 29.59 180 top
R39  NC  [R0402]  2.71 27.39 180 top
R40  180kΩ  [R0402]  44.7 28.02 180 bottom
R41  180kΩ  [R0402]  44.7 27.03 180 bottom
R46  10kΩ  [R0402]  48.49 28.02 180 bottom
R47  10kΩ  [R0402]  48.49 27.03 180 bottom
R59  1K  [R0402]  39.04 43.79 270 top
R86  470R  [R0402]  63.09 38.02 90 top
R88  470R  [R0402]  64.08 38.02 90 top
R130  2.2kΩ/NC  [R0402]  44.15 30.06 0 bottom
R169  4.7K  [R0402]  63.73 50.14 90 bottom
R194  1MΩ  [R0402]  65.61 15.79 270 top
R195  1MΩ  [R0402]  68.58 15.79 270 top
R229  2Ω  [R0603]  48.06 29.19 180 bottom
R230  1kΩ  [R0402]  44.14 31.06 180 bottom
R231  1kΩ  [R0402]  60.45 34.24 90 top
R232  10kΩ  [R0402]  50.82 29.78 90 top
R234  47pF  [R0402]  55.75 31.27 0 top
R235  100kΩ  [R0402]  50.82 31.7 270 top
R236  10kΩ  [R0402]  51.99 31.7 90 top
R237  0Ω  [R0402]  49.15 24.79 0 bottom
R238  0Ω  [R0402]  49.15 25.78 0 bottom
R239  0Ω  [R0402]  76.56 24.97 180 bottom
R240  2.2kΩ/NC  [R0402]  44.15 29.06 0 bottom
R253  1M  [R0402]  53.03 21.31 0 bottom
R274  5R  [R0402]  47.73 30.2 0 top
R289  15kΩ  [R0402]  39.91 35.7 180 top
R290  3.32kΩ  [R0402]  38.23 35.55 90 top
R298  10kΩ  [R0402]  46.58 28.02 180 bottom
R299  10kΩ  [R0402]  46.59 27.02 180 bottom
R318  100R  [R0603]  85.44 12.27 90 top
R319  10K  [R0402]  83.84 13.18 0 top
R320  10K  [R0402]  85.21 9.59 0 top
R321  10K  [R0402]  82.85 16.7 90 top
R322  10K  [R0402]  83.6 37.13 90 top
R323  100K  [R0402]  83.34 15.27 180 top
R324  100K  [R0402]  82.73 35.69 180 top
R325  10K  [R0402]  84.99 34.7 0 top
R326  100R  [R0603]  82.07 31.5 90 top
R327  10K  [R0402]  80.52 25.07 180 top
R332  499R  [R0201]  49.47 36.69 270 top
R333  499R  [R0201]  48.66 36.69 270 top
R334  499R  [R0201]  47.84 36.69 270 top
R335  499R  [R0201]  47.03 36.69 270 top
R336  499R  [R0201]  46.21 36.69 270 top
R337  499R  [R0201]  45.4 36.69 270 top
R338  499R  [R0201]  44.59 36.69 270 top
R339  499R  [R0201]  43.77 36.69 270 top
R378  15K  [R0402]  17.27 15.56 90 top
R379  20K  [R0402]  2.08 15.14 0 top
R380  10K  [R0402]  2.08 16.13 180 top
R381  12K  [R0402]  16.26 17.44 90 top
R382  43K  [R0402]  2.54 17.58 90 top
R388  33K  [R0402]  19.84 33.35 270 top
R389  33K  [R0402]  14.6 31.02 180 bottom
R390  33K  [R0402]  14.6 32.02 180 bottom
R391  33K  [R0402]  14.6 33.02 180 bottom
R392  33K  [R0402]  14.62 34.02 180 bottom
R393  33K  [R0402]  14.62 35.02 180 bottom
R394  NC  [R0402]  2.71 28.49 180 top
R395  NC  [R0402]  2.71 26.29 180 top
R396  33K  [R0402]  18.85 33.35 270 top
R397  0R  [R0402]  20.83 33.35 90 top
R398  0R  [R0402]  17.86 33.35 90 top
R408  10K  [R0402]  38 43.79 90 top
R439  732K  [R0402]  83.97 49.78 180 bottom
R440  100K  [R0402]  83.97 50.8 0 bottom
R441  100K  [R0402]  31.52 42.37 0 bottom
R442  13.3K  [R0402]  29.49 42.37 0 bottom
R443  49.9R  [R0402]  33.55 42.37 0 bottom
R444  100K  [R0402]  36.5 45.01 270 top
R445  100K  [R0402]  36.5 46.89 270 top
R451  470Ω  [RES0402]  14.58 45.92 180 bottom
R454  1M  [R0402]  18.44 28.02 90 bottom
R455  15kΩ  [R0402]  2.71 31.48 0 top
R456  3.32kΩ  [R0402]  2.71 33.76 0 top
R457  100kΩ  [R0402]  2.71 34.9 180 top
R458  15kΩ  [R0402]  51.76 39.07 90 top
R459  3.32kΩ  [R0402]  53.37 39.65 180 top
R460  100kΩ  [R0402]  54.71 37.97 270 top
R461  100kΩ  [R0402]  37.23 35.55 90 top
R463  10K  [R0402]  24.48 34.62 270 bottom
R464  10K  [R0402]  30.1 32.08 180 bottom
R465  10K  [R0402]  24.48 36.72 270 bottom
R466  300K  [R0402]  20.8 17.88 0 top
R467  100K  [R0402]  18.92 17.88 0 top
R468  0R  [R0402]  17.35 48.59 0 top
R469  4.7K  [R0402]  30.66 15.55 180 top
R470  4.7K  [R0402]  30.66 16.54 180 top
R471  10K  [R0402]  21.17 31.26 270 bottom
R472  10K  [R0402]  22.61 34.62 270 bottom
R473  10K  [R0402]  22.61 36.72 270 bottom
R474  10K  [R0402]  30.1 34.57 180 bottom
R475  75R  [R0603]  72.59 35.76 90 top
R476  75R  [R0603]  68.78 35.76 90 top
R477  75R  [R0603]  74.5 35.76 90 top
R478  75R  [R0603]  70.69 35.76 90 top
R479  10K  [R0402]  62.33 25.48 180 bottom
R480  10K  [R0402]  62.33 26.47 180 bottom
R481  10K  [R0402]  33.55 30.81 135 bottom
R482  1K  [R0402]  37.08 41.78 270 top
R483  1K  [R0402]  38.73 41.35 180 top
RJ1  X39ADAB1W6DB1075  [RJ45-TH_XKB_X39ADAB1W6DB1075]  72.84 41.96 0 bottom
TP18  -  [Test-Point-0.5mm]  3.66 29.1 270 bottom
TP19  -  [Test-Point-0.5mm]  1.66 29.1 270 bottom
TP20  -  [Test-Point-0.5mm]  2.66 29.1 270 bottom
TP21  -  [Test-Point-0.5mm]  0.95 28.48 0 top
TP22  -  [Test-Point-0.5mm]  0.95 27.48 0 top
TP23  -  [Test-Point-0.5mm]  0.95 26.48 0 top
TP27  -  [Test-Point-0.5mm]  6.87 33.18 180 bottom
TP28  -  [Test-Point-0.5mm]  8.16 33.18 180 bottom
TP29  -  [Test-Point-0.5mm]  9.45 33.18 270 bottom
TP30  -  [Test-Point-0.5mm]  5.58 33.18 270 bottom
TP31  -  [Test-Point-0.5mm]  31.65 28.7 90 bottom
TP32  -  [Test-Point-0.5mm]  32.56 29.01 90 bottom
U1  425ba8b319070fcb  [QFN-20_L3.0-W3.0-P0.40-TL-EP1.8]  15.51 43.52 270 top
U2  EA3059  [VQFN-24_L4.0-W4.0-P0.50-TL-EP2.5]  9.3 16.82 0 top
U3  5fed965361926d14  [QFN-44_L12.0-W12.0-WiFi]  10.63 30.59 90 top
U4  ETA3521FSG  [SOT-563-6_L1.6-W1.2-P0.5-LS1.6-BL]  46.71 16.1 0 top
U5  TP4056  [ESOP-8_L4.9-W3.9-P1.27-LS6.0-BL-EP]  83.87 48.24 180 top
U10  ETA3521FSG  [SOT-563-6_L1.6-W1.2-P0.5-LS1.6-BL]  37.73 37.78 180 top
U12  0R  [R0402_1]  31.46 27.67 180 bottom
U13/NC1  10K  [R0402_1]  30.31 26.67 180 bottom
U16  10K  [R0402_1]  24.87 20.12 90 bottom
U17  GL823K  [SSOP-16_L4.9-W3.9-P0.64-LS6.0-BL]  26.43 26.02 0 bottom
U18  SML-LX0603SRW-TR  [LED0603-RD_RED]  27.1 20.27 180 bottom
U19  CSNP4GCR01-BOW  [LGA-8_L6.0-W8.0-P1.27-TL]  27.75 27.09 90 top
U35  -  [DFN1006-2L_L1.0-W0.6-P0.70-BI]  42.19 44.04 270 top
U36  -  [DFN1006-2L_L1.0-W0.6-P0.70-BI]  41.71 39.78 90 bottom
U37  -  [DFN1006-2L_L1.0-W0.6-P0.70-BI]  40.66 39.78 90 bottom
U38  -  [DFN1006-2L_L1.0-W0.6-P0.70-BI]  40.18 44.04 270 top
U52  -  [DFN1006-2L_L1.0-W0.6-P0.70-BI]  31.94 12.57 0 top
U53  -  [DFN1006-2L_L1.0-W0.6-P0.70-BI]  30.44 12.57 180 top
U74  CH347T  [TSSOP-20_L6.5-W4.4-P0.65-LS6.4-BL]  59.85 45.31 270 bottom
U92  VL171  [VL170]  69.98 19.77 180 bottom
U97  ETA3521FSG  [SOT-563-6_L1.6-W1.2-P0.5-LS1.6-BL]  51.41 33.83 180 top
U98  CS5366A  [QFN-68_L8.0-W8.0-P0.40-TL-EP5.7]  55.22 26.9 90 bottom
U108  SY7200AABC  [SOT-23-6_L2.9-W1.6-P0.95-LS2.8-BR]  46.83 32.75 270 top
U116  -  [DFN1006-2L_L1.0-W0.6-P0.70-BI]  7.97 12.8 270 top
U117  -  [DFN1006-2L_L1.0-W0.6-P0.70-BI]  10.87 12.8 270 top
U118  RS2227XN  [MSOP-10_L3.0-W3.0-P0.50-LS5.0-BL]  45.9 22.07 90 bottom
U120  SMTSO2520CTJ  [SMD_BD5.6-L5.6-W5.6-D4.1]  31.23 38.65 180 bottom
U121  SMTSO2520CTJ  [SMD_BD5.6-L5.6-W5.6-D4.1]  58.58 38.65 180 bottom
U131  de476d111a8f50c6  [QFN-88_L9.0-W9.0-P0.35-TL-EP7.0]  12.37 24.51 0 bottom
U148  TPS61023DRLR  [SOT-563_L1.6-W1.2-P0.50-LS1.6-BR]  84.07 48.24 0 bottom
U149  SGM61230XTN6G/TR  [SOT-23-6_L2.9-W1.6-P0.95-LS2.8-BR]  30.29 45.02 90 bottom
U150  25MHz  [CRYSTAL-SMD_4P-L2.0-W1.6-BL]  53.24 19.2 0 bottom
U151  ETA3521FSG  [SOT-563-6_L1.6-W1.2-P0.5-LS1.6-BL]  2.16 35.07 90 bottom
U152  ETA3521FSG  [SOT-563-6_L1.6-W1.2-P0.5-LS1.6-BL]  53.31 38.1 0 top
U153  -  [DFN1006-2L_L1.0-W0.6-P0.70-BI]  26.47 44.35 90 bottom
U154  -  [DFN1006-2L_L1.0-W0.6-P0.70-BI]  15.7 42.55 270 bottom
U155  YZ104614067F-03020-02  [CONN-SMD_YZ104614067F-03020-02]  7.29 36.45 180 bottom
U156  RS0108YTQC20  [QFN-20_L3.0-W3.0-P0.40-BL-EP1.7]  36.12 18.87 270 top
U157  CH338F  [QFN-32_L4.0-W4.0-P0.40-TL-EP2.7]  36.11 27.47 135 bottom
U158  CH397A  [QFN-24_L4.0-W4.0-P0.50-BL-EP2.8]  69.7 22.58 180 top
USB1  U-C-19DD-W-1  [HDMI-SMD_U-C-19DD-W-1]  44.7 45.46 0 bottom
USB9  HC-ST-003-008-Z  [USB-3.0-A-SMD_ST-003-008-J]  31.15 9.65 180 bottom
USB10  HC-ST-003-008-Z  [USB-3.0-A-SMD_ST-003-008-J]  53.15 9.65 180 bottom
USB11  TYPE-C 24P QCHT  [TYPE-C-SMD_TYPE-C-24P-QCHT]  81.98 19.65 270 bottom
USB12  TYPE-C 24P QCHT  [TYPE-C-SMD_TYPE-C-24P-QCHT]  81.98 32.96 270 bottom
USB16  HC-ST-003-008-Z  [USB-3.0-A-SMD_ST-003-008-J]  9.15 9.65 180 bottom
X1  25MHz  [CRYSTAL-SMD_4P-L2.0-W1.6-BL]  20.57 28.19 90 bottom
X13  8MHz  [CRYSTAL-SMD_4P-L3.2-W2.5-BL]  58.65 50.39 0 bottom
X14  25MHz  [CRYSTAL-SMD_4P-L2.0-W1.6-BL]  73.8 22.35 270 top
X15  25MHz  [CRYSTAL-SMD_4P-L2.0-W1.6-BL]  36.58 22.47 180 bottom

## Footprints (pads in the part's own frame, mm; a bottom-side part is the same pattern mirrored in y, then rotated)
AUDIO-SMD_PJ-342D
  rect 1.5x1.75 smd: 1(-4.3,-4.295) 2(-4.4,4.295) 3(-1.6,-4.295) 4(2.2,4.295) 5(4.4,4.295) 6(3.4,-4.295)
C0201
  rect 0.368x0.324 smd: 1(-0.275,0) 2(0.275,0)
C0402
  rect 0.79x0.54 smd: 1(-0.545,0) 2(0.545,0)
C0402_1
  rect 0.79x0.54 smd: 1(-0.545,0) 2(0.545,0)
C0603
  rect 0.8x0.9 smd: 1(-0.7,0) 2(0.7,0)
C0603_1
  rect 0.8x0.9 smd: 1(-0.7,0) 2(0.7,0)
C0805
  rect 1.41x1.35 smd: 1(-1,0) 2(1,0)
C1206
  rect 1.485x1.728 smd: 1(-1.593,0) 2(1.593,0)
CAP-SMD_L7.3-W4.3-RD_177EC0013
  rect 2x3 smd: 1(-3,0) 2(3,0)
CONN-SMD_GT-F0509SR15-15SMT01
  rect 0.3x0.65 smd: 1(-3.5,1.387) 2(-3,1.387) 3(-2.5,1.387) 4(-2.001,1.387) 5(-1.5,1.387) 6(-1,1.387) 7(-0.5,1.387) 8(-0.001,1.387) 9(0.499,1.387) 10(1,1.387) 11(1.5,1.387) 12(2,1.387) 13(2.499,1.387) 14(2.999,1.387) 15(3.499,1.387)
  rect 1.1x1.8 smd: 16(-5.5,-1.387) 17(5.5,-1.387)
CONN-SMD_YZ104614067F-03020-02
  rect 1x3.8 smd: 1(-2,0) 2(0,0) 3(2,0)
CRYSTAL-SMD_4P-L2.0-W1.6-BL
  rect 0.9x0.8 smd: 1(-0.7,-0.55) 2(0.7,-0.55) 3(0.7,0.55) 4(-0.7,0.55)
CRYSTAL-SMD_4P-L3.2-W2.5-BL
  rect 1.4x1.2 smd: 1(-1.1,-0.85) 2(1.1,-0.85) 3(1.1,0.85) 4(-1.1,0.85)
D0603-BI
  rect 0.873x0.907 smd: 1(-0.622,0) 2(0.622,0)
DFN1006-2L_L1.0-W0.6-P0.70-BI
  rect 0.399x0.6 smd: 1(-0.35,0) 2(0.35,0)
DFN2510-10_L2.5-W1.0-P0.50-BL
  rect 0.2x0.665 smd: 1(-1,-0.433) 2(-0.5,-0.433) 4(0.5,-0.433) 5(1,-0.433) 6(1,0.433) 7(0.5,0.433) 9(-0.5,0.433) 10(-1,0.433)
  rect 0.4x0.665 smd: 3(0,-0.433) 8(0,0.433)
ESOP-8_L4.9-W3.9-P1.27-LS6.0-BL-EP
  rect 0.6x1.2 smd: 1(-1.905,-2.909) 2(-0.635,-2.909) 3(0.635,-2.909) 4(1.905,-2.909) 5(1.905,2.909) 6(0.635,2.909) 7(-0.635,2.909) 8(-1.905,2.909)
  rect 3.3x2.4 smd: 9(0,0)
F1206
  rect 1.19x1.728 smd: 1(-1.445,0) 2(1.445,0)
HDMI-SMD_U-C-19DD-W-1
  round 0.8 hole 0.5: 1(4.5,2.7) 2(4,3.9) 3(3.5,2.7) 4(3,3.9) 5(2.5,2.7) 7(1.5,2.7) 9(0.5,2.7) 11(-0.5,2.7) 12(-1,3.9) 13(-1.5,2.7) 14(-2,3.9) 15(-2.5,2.7) 16(-3,3.9) 17(-3.5,2.7) 18(-4,3.9) 19(-4.5,2.7)
  oval 0.55x0.8 hole 0.45: 6(2.02,3.9) 8(1,3.9) 10(-0.02,3.9)
  oval 1.5x3.2 hole 0.8x2.5: 20(-9.15,3.75) 23(9.15,3.75)
  oval 1.5x2.7 hole 0.8x2: 21(-9.15,-3.9) 22(9.15,-3.9)
HDR-TH_2P-P2.54-V-M-1
  rect 1.8x1.8 hole 1: 1(-1.27,0)
  round 1.8 hole 1: 2(1.27,0)
HDR-TH_12P-P2.54-H-F-R2-C6-S2.54-W10.2
  rect 1.778x1.778 hole 1.27: 1(-6.35,1.27)
  round 1.778 hole 1.27: 2(-6.35,-1.27) 3(-3.81,1.27) 4(-3.81,-1.27) 5(-1.27,1.27) 6(-1.27,-1.27) 7(1.27,1.27) 8(1.27,-1.27) 9(3.81,1.27) 10(3.81,-1.27) 11(6.35,1.27) 12(6.35,-1.27)
IND-SMD_L2.5-W2.0
  rect 1.2x2.2 smd: 1(1.028,0) 2(-1.028,0)
IND-SMD_L2.5-W2.0-VLS252012CX-150M
  rect 0.85x2 smd: 1(-0.83,0) 2(0.83,0)
IND-SMD_L2.5-W2.0_YXMBL252010P
  rect 1x2 smd: 1(1.1,0) 2(-1.1,0)
IND-SMD_L3.2-W2.5_CKST322512-2.2UH
  rect 1.2x2.7 smd: 1(-1.25,0) 2(1.25,0)
L0402
  rect 0.79x0.54 smd: 1(-0.545,0) 2(0.545,0)
LED0402
  rect 0.636x0.54 smd: 1(-0.538,0) 2(0.538,0)
LED0603-RD_RED
  rect 0.8x0.8 smd: 1(-0.799,-0.004) 2(0.799,0.004)
LED-SMD_NCD3010RG1
  rect 0.6x1.4 smd: 1(-1.4,0.313) 3(1.4,0.312)
  rect 1.1x0.65 smd: 2(0,-0.313)
LED_0402
  rect 0.637x0.541 smd: 1(-0.538,0) 2(0.538,0)
LGA-8_L6.0-W8.0-P1.27-TL
  rect 1.7x0.8 smd: 1(-3.701,1.905) 2(-3.701,0.635) 3(-3.701,-0.635) 4(-3.701,-1.905) 5(3.701,-1.905) 6(3.701,-0.635) 7(3.701,0.635) 8(3.701,1.905)
MSOP-10_L3.0-W3.0-P0.50-LS5.0-BL
  oval 0.28x1.621 smd: 1(-1.001,-2.111) 2(-0.5,-2.111) 3(0,-2.111) 4(0.5,-2.111) 5(1.001,-2.111) 6(1.001,2.111) 7(0.5,2.111) 8(0,2.111) 9(-0.5,2.111) 10(-1.001,2.111)
POWERDI3333-8_DMN7022LFGQ-7
  rect 0.42x1 smd: 1(-0.975,-1.025) 2(-0.325,-1.025) 3(0.325,-1.025) 4(0.975,-1.025)
  custom 2.39x2.23 smd: 5(0.005,1.025)
QFN-20_L3.0-W3.0-P0.40-BL-EP1.7
  rect 0.2x0.665 smd: 1(-0.8,-1.407) 2(-0.4,-1.407) 3(0,-1.407) 4(0.4,-1.407) 5(0.8,-1.407) 11(0.8,1.407) 12(0.4,1.407) 13(0,1.407) 14(-0.4,1.407) 15(-0.8,1.407)
  rect 0.665x0.2 smd: 6(1.407,-0.8) 7(1.407,-0.4) 8(1.407,0) 9(1.407,0.4) 10(1.407,0.8) 16(-1.407,0.8) 17(-1.407,0.4) 18(-1.407,0) 19(-1.407,-0.4) 20(-1.407,-0.8)
  rect 1.65x1.65 smd: 21(0,0)
QFN-20_L3.0-W3.0-P0.40-TL-EP1.8
  rect 0.7x0.2 smd: 1(-1.55,0.8) 2(-1.55,0.4) 3(-1.55,0) 4(-1.55,-0.4) 5(-1.55,-0.8) 11(1.55,-0.8) 12(1.55,-0.4) 13(1.55,0) 14(1.55,0.4) 15(1.55,0.8)
  rect 0.2x0.7 smd: 6(-0.8,-1.55) 7(-0.4,-1.55) 9(0.4,-1.55) 10(0.8,-1.55) 16(0.8,1.55) 17(0.4,1.55) 18(0,1.55) 19(-0.4,1.55) 20(-0.8,1.55)
  rect 1.8x1.8 smd: 21(0,0)
QFN-24_L4.0-W4.0-P0.50-BL-EP2.8
  oval 0.28x0.7 smd: 1(-1.25,-2) 2(-0.75,-2) 3(-0.25,-2) 4(0.25,-2) 5(0.75,-2) 6(1.25,-2) 13(1.25,2) 14(0.75,2) 15(0.25,2) 16(-0.25,2) 17(-0.75,2) 18(-1.25,2)
  oval 0.7x0.28 smd: 7(2,-1.25) 8(2,-0.75) 9(2,-0.25) 10(2,0.25) 11(2,0.75) 12(2,1.25) 19(-2,1.25) 20(-2,0.75) 21(-2,0.25) 22(-2,-0.25) 23(-2,-0.75) 24(-2,-1.25)
  rect 2.8x2.8 smd: 25(0.013,0)
QFN-32_L4.0-W4.0-P0.40-TL-EP2.7
  rect 0.76x0.2 smd: 1(-2.08,1.4) 2(-2.08,1) 3(-2.08,0.6) 4(-2.08,0.2) 5(-2.08,-0.2) 6(-2.08,-0.6) 7(-2.08,-1) 8(-2.08,-1.4) 17(2.08,-1.4) 18(2.08,-1) 19(2.08,-0.6) 20(2.08,-0.2) 21(2.08,0.2) 22(2.08,0.6) 23(2.08,1) 24(2.08,1.4)
  rect 0.2x0.76 smd: 9(-1.4,-2.08) 10(-1,-2.08) 11(-0.6,-2.08) 12(-0.2,-2.08) 13(0.2,-2.08) 14(0.6,-2.08) 15(1,-2.08) 16(1.4,-2.08) 25(1.4,2.08) 26(1,2.08) 27(0.6,2.08) 28(0.2,2.08) 29(-0.2,2.08) 30(-0.6,2.08) 31(-1,2.08) 32(-1.4,2.08)
  rect 2.7x2.7 smd: 33(0,0)
QFN-44_L12.0-W12.0-WiFi
  rect 1x0.6 smd: 1(-5.699,4.496) 2(-5.699,3.607) 3(-5.699,2.692) 4(-5.699,1.804) 5(-5.699,0.889) 6(-5.699,0) 7(-5.699,-0.889) 8(-5.699,-1.804) 9(-5.699,-2.692) 10(-5.699,-3.607) 11(-5.699,-4.496) 23(5.697,-4.496) 24(5.697,-3.607) 25(5.697,-2.692) 26(5.697,-1.804) 27(5.697,-0.889) 28(5.697,0) 29(5.697,0.889) 30(5.697,1.804) 31(5.697,2.692) 32(5.697,3.607) 33(5.697,4.496)
  rect 0.6x1 smd: 12(-4.496,-5.702) 13(-3.607,-5.702) 14(-2.692,-5.702) 15(-1.804,-5.702) 16(-0.889,-5.702) 17(0,-5.702) 18(0.889,-5.702) 19(1.804,-5.702) 20(2.692,-5.702) 21(3.607,-5.702) 22(4.496,-5.702) 34(4.496,5.697) 36(2.692,5.697) 37(1.804,5.697) 38(0.889,5.697) 39(0,5.697) 40(-0.889,5.697) 41(-1.804,5.697) 42(-2.692,5.697) 43(-3.607,5.697) 44(-4.496,5.697)
QFN-68_L8.0-W8.0-P0.40-TL-EP5.7
  rect 0.9x0.2 smd: 1(-3.95,3.2) 2(-3.95,2.8) 3(-3.95,2.4) 4(-3.95,2) 5(-3.95,1.6) 6(-3.95,1.2) 7(-3.95,0.8) 8(-3.95,0.4) 9(-3.95,0) 10(-3.95,-0.4) 11(-3.95,-0.8) 12(-3.95,-1.2) 13(-3.95,-1.6) 14(-3.95,-2) 15(-3.95,-2.4) 16(-3.95,-2.8) 17(-3.95,-3.2) 35(3.95,-3.2) 36(3.95,-2.8) 37(3.95,-2.4) 38(3.95,-2) 39(3.95,-1.6) 40(3.95,-1.2) 41(3.95,-0.8) 42(3.95,-0.4) 43(3.95,0) 44(3.95,0.4) 45(3.95,0.8) 46(3.95,1.2) 47(3.95,1.6) 48(3.95,2) 49(3.95,2.4) 50(3.95,2.8) 51(3.95,3.2)
  rect 0.2x0.9 smd: 18(-3.2,-3.95) 19(-2.8,-3.95) 20(-2.4,-3.95) 21(-2,-3.95) 22(-1.6,-3.95) 23(-1.2,-3.95) 24(-0.8,-3.95) 25(-0.4,-3.95) 26(0,-3.95) 27(0.4,-3.95) 28(0.8,-3.95) 29(1.2,-3.95) 30(1.6,-3.95) 31(2,-3.95) 32(2.4,-3.95) 33(2.8,-3.95) 34(3.2,-3.95) 52(3.2,3.95) 53(2.8,3.95) 54(2.4,3.95) 55(2,3.95) 56(1.6,3.95) 57(1.2,3.95) 58(0.8,3.95) 59(0.4,3.95) 60(0,3.95) 61(-0.4,3.95) 62(-0.8,3.95) 63(-1.2,3.95) 64(-1.6,3.95) 65(-2,3.95) 66(-2.4,3.95) 67(-2.8,3.95) 68(-3.2,3.95)
  rect 5.5x5.5 smd: 69(0,0)
QFN-88_L9.0-W9.0-P0.35-TL-EP7.0
  rect 0.74x0.15 smd: 1(-4.407,3.675) 2(-4.407,3.325) 3(-4.407,2.975) 4(-4.407,2.625) 5(-4.407,2.275) 6(-4.407,1.925) 7(-4.407,1.575) 8(-4.407,1.225) 9(-4.407,0.875) 10(-4.407,0.525) 11(-4.407,0.175) 12(-4.407,-0.175) 13(-4.407,-0.525) 14(-4.407,-0.875) 15(-4.407,-1.225) 16(-4.407,-1.575) 17(-4.407,-1.925) 18(-4.407,-2.275) 19(-4.407,-2.625) 20(-4.407,-2.975) 21(-4.407,-3.325) 22(-4.407,-3.675) 45(4.407,-3.675) 46(4.407,-3.325) 47(4.407,-2.975) 48(4.407,-2.625) 49(4.407,-2.275) 50(4.407,-1.925) 51(4.407,-1.575) 52(4.407,-1.225) 53(4.407,-0.875) 54(4.407,-0.525) 55(4.407,-0.175) 56(4.407,0.175) 57(4.407,0.525) 58(4.407,0.875) 59(4.407,1.225) 60(4.407,1.575) 61(4.407,1.925) 62(4.407,2.275) 63(4.407,2.625) 64(4.407,2.975) 65(4.407,3.325) 66(4.407,3.675)
  rect 0.15x0.74 smd: 23(-3.675,-4.407) 24(-3.325,-4.407) 25(-2.975,-4.407) 26(-2.625,-4.407) 27(-2.275,-4.407) 28(-1.925,-4.407) 29(-1.575,-4.407) 30(-1.225,-4.407) 31(-0.875,-4.407) 32(-0.525,-4.407) 33(-0.175,-4.407) 34(0.175,-4.407) 35(0.525,-4.407) 36(0.875,-4.407) 37(1.225,-4.407) 38(1.575,-4.407) 39(1.925,-4.407) 40(2.275,-4.407) 41(2.625,-4.407) 42(2.975,-4.407) 43(3.325,-4.407) 44(3.675,-4.407) 67(3.675,4.407) 68(3.325,4.407) 69(2.975,4.407) 70(2.625,4.407) 71(2.275,4.407) 72(1.925,4.407) 73(1.575,4.407) 74(1.225,4.407) 75(0.875,4.407) 76(0.525,4.407) 77(0.175,4.407) 78(-0.175,4.407) 79(-0.525,4.407) 80(-0.875,4.407) 81(-1.225,4.407) 82(-1.575,4.407) 83(-1.925,4.407) 84(-2.275,4.407) 85(-2.625,4.407) 86(-2.975,4.407) 87(-3.325,4.407) 88(-3.675,4.407)
  rect 6.5x6.5 smd: 89(0,0)
R0201
  rect 0.303x0.324 smd: 1(-0.241,0) 2(0.241,0)
R0402
  rect 0.566x0.54 smd: 1(-0.433,0) 2(0.433,0)
R0402_1
  rect 0.566x0.54 smd: 1(-0.433,0) 2(0.433,0)
R0603
  rect 0.806x0.864 smd: 1(-0.753,0) 2(0.753,0)
RES0402
  rect 0.5x0.5 smd: 1(-0.45,0) 2(0.45,0)
RF-SMD_FRF05002-JSS103M
  rect 1x1.05 smd: 1(0,-0.762)
  rect 1.05x2.2 smd: 2(-1.475,0.762) 3(1.475,0.762)
RJ45-TH_XKB_X39ADAB1W6DB1075
  round 1.3 hole 0.9: 1(3.57,2.65) 2(2.55,3.75) 3(1.53,2.65) 4(0.51,3.75) 5(-0.51,2.65) 6(-1.53,3.75) 7(-2.55,2.65) 8(-3.57,3.75)
  round 1.5 hole 1: 9(7.075,1.57) 10(4.785,1.57) 11(-4.785,1.57) 12(-7.075,1.57)
  oval 1.2x2.8 hole 0.7x2.2: 13(8.04,-3.75) 14(-8.04,-3.75)
SC-75-3_L1.6-W0.8-P1.00-LS1.7-BR
  rect 0.585x0.301 smd: 1(0.642,-0.5) 2(0.642,0.5) 3(-0.642,0)
SMD_BD5.6-L5.6-W5.6-D4.1
  custom 3.04x3.04 smd: 1(-1.623,-2.167) 1(-1.609,2.171) 1(1.617,-2.171) 1(1.623,2.141)
SOD-323_L1.8-W1.3-LS2.5-RD
  rect 1x0.75 smd: 1(-1.173,0) 2(1.173,0)
SOT-23-3_L2.9-W1.3-P1.90-LS2.4-BR
  rect 1.25x0.7 smd: 1(1,-0.95) 2(1,0.95) 3(-1,0)
SOT-23-6_L2.9-W1.6-P0.95-LS2.8-BR
  rect 1.1x0.6 smd: 1(1.35,-0.95) 2(1.35,0) 3(1.35,0.95) 4(-1.35,0.95) 5(-1.35,0) 6(-1.35,-0.95)
SOT-563-6_L1.6-W1.2-P0.5-LS1.6-BL
  rect 0.28x0.68 smd: 1(-0.5,-0.64) 2(0,-0.64) 3(0.5,-0.64) 4(0.5,0.64) 5(0,0.64) 6(-0.5,0.64)
SOT-563_L1.6-W1.2-P0.50-LS1.6-BR
  rect 0.6x0.3 smd: 1(0.75,-0.5) 2(0.75,0) 3(0.75,0.5) 4(-0.75,0.5) 5(-0.75,0) 6(-0.75,-0.5)
SSOP-16_L4.9-W3.9-P0.64-LS6.0-BL
  oval 0.355x1.815 smd: 1(-2.223,-2.655) 2(-1.587,-2.655) 3(-0.953,-2.655) 4(-0.318,-2.655) 5(0.318,-2.655) 6(0.953,-2.655) 7(1.587,-2.655) 8(2.223,-2.655) 9(2.223,2.655) 10(1.587,2.655) 11(0.953,2.655) 12(0.318,2.655) 13(-0.318,2.655) 14(-0.953,2.655) 15(-1.587,2.655) 16(-2.223,2.655)
Test-Point-0.5mm
  round 0.5 smd: 1(0,0)
TF-SMD_TF-021B-H265
  rect 0.7x1.2 smd: 1(3.775,1.25) 2(2.675,1.25) 3(1.575,1.25) 4(0.475,1.25) 5(-0.625,1.25) 6(-1.725,1.25) 7(-2.825,1.25) 8(-3.925,1.25)
  rect 1.5x3.8 smd: 9(-5.425,-1.25)
  rect 1.45x1.4 smd: 10(5.425,-0.5)
TSSOP-20_L6.5-W4.4-P0.65-LS6.4-BL
  oval 0.364x1.742 smd: 1(-2.925,-2.871) 2(-2.275,-2.871) 3(-1.625,-2.871) 4(-0.975,-2.871) 5(-0.325,-2.871) 6(0.325,-2.871) 7(0.975,-2.871) 8(1.625,-2.871) 9(2.275,-2.871) 10(2.925,-2.871) 11(2.925,2.871) 12(2.275,2.871) 13(1.625,2.871) 14(0.975,2.871) 15(0.325,2.871) 16(-0.325,2.871) 17(-0.975,2.871) 18(-1.625,2.871) 19(-2.275,2.871) 20(-2.925,2.871)
TYPE-C-SMD_TYPE-C-24P-QCHT
  oval 1x1.6 hole 0.6x1.2: 25(-4.49,-3.158) 25(-4.13,1.232) 25(4.13,1.232) 25(4.49,-3.158)
  rect 0.275x1.25 smd: A1(-2.79,3.158) A2(-2.25,3.158) A3(-1.75,3.158) A4(-1.25,3.158) A5(-0.75,3.158) A6(-0.25,3.158) A7(0.25,3.158) A8(0.75,3.158) A9(1.25,3.158) A10(1.75,3.158) A11(2.25,3.158) A12(2.75,3.158)
  round 0.6 hole 0.4: B1(2.8,1.833) B2(2.4,1.133) B3(1.601,1.133) B4(1.2,1.833) B5(0.8,1.133) B6(0.4,1.833) B7(-0.4,1.833) B8(-0.8,1.133) B9(-1.2,1.833) B10(-1.6,1.133) B11(-2.4,1.133) B12(-2.8,1.833)
USB-3.0-A-SMD_ST-003-008-J
  rect 0.7x1.6 smd: 1(-3,3.95) 2(-1,3.95) 3(1,3.95) 4(3,3.95) 5(4,3.95) 6(2,3.95) 7(0,3.95) 8(-2,3.95) 9(-4,3.95)
  oval 1.2x3 hole 0.61x2.5: 10(-8,3.15) 10(8,3.15)
  rect 1.6x1.5 smd: 10(-7.6,-3.95) 10(-7.6,-0.75) 10(7.6,-3.95) 10(7.6,-0.75)
VL170
  rect 0.7x0.2 smd: 1(-1.7,1.8) 2(-1.7,1.4) 3(-1.7,1) 4(-1.7,0.6) 5(-1.7,0.2) 6(-1.7,-0.2) 7(-1.7,-0.6) 8(-1.7,-1) 9(-1.7,-1.4) 10(-1.7,-1.8) 15(1.7,-1.8) 16(1.7,-1.4) 17(1.7,-1) 18(1.7,-0.6) 19(1.7,-0.2) 20(1.7,0.2) 21(1.7,0.6) 22(1.7,1) 23(1.7,1.4) 24(1.7,1.8)
  rect 0.2x0.7 smd: 11(-0.6,-2.2) 12(-0.2,-2.2) 13(0.2,-2.2) 14(0.6,-2.2) 25(0.6,2.2) 26(0.2,2.2) 27(-0.2,2.2) 28(-0.6,2.2)
  rect 1.9x3 smd: 29(0,0)
VQFN-24_L4.0-W4.0-P0.50-TL-EP2.5
  rect 0.6x0.25 smd: 1(-1.9,1.25) 2(-1.9,0.75) 3(-1.9,0.25) 4(-1.9,-0.25) 5(-1.9,-0.75) 6(-1.9,-1.25) 13(1.9,-1.25) 14(1.9,-0.75) 15(1.9,-0.25) 16(1.9,0.25) 17(1.9,0.75) 18(1.9,1.25)
  rect 0.25x0.6 smd: 7(-1.25,-1.9) 8(-0.75,-1.9) 9(-0.25,-1.9) 10(0.249,-1.9) 11(0.75,-1.9) 12(1.25,-1.9) 19(1.25,1.9) 20(0.75,1.9) 21(0.249,1.9) 22(-0.25,1.9) 23(-0.75,1.9) 24(-1.25,1.9)
  rect 2.45x2.45 smd: 25(0,0)
XFMR-SMD_12P-P1.27_HX0068ANLTP
  rect 0.762x1.71 smd: 1(-4.444,-4.225) 2(-3.175,-4.225) 3(-1.905,-4.225) 4(1.905,-4.225) 5(3.175,-4.225) 6(4.445,-4.225) 7(4.445,4.225) 8(3.175,4.225) 9(1.905,4.225) 10(-1.905,4.225) 11(-3.175,4.225) 12(-4.445,4.225)

## Nets
As in the schematic, except:
$6N9191: C425.2 R195.1 U92.13
$6N9192: C426.2 R194.1 U92.14

Pads without a net: CN2 5 6; U1 1 5; U2 15 16; U3 4 6 7 8 10 11 13 21 23 25 26 27 28 29 30 32 34 37 38 39 40; U92 20 21 23 24; U98 8 9 10 11 35 50 53 54 56 57; U131 35 47 49 58 72 73 74 75 76 77 78 79 80 81 87 88; U156 18 19; U157 23 24 25 26 27; U158 12 14 16 19 20; USB1 13 14; USB9 5 6 8 9; USB12 A2 A3 A10 A11 B2 B3 B10 B11; USB16 5 6 8 9

## Via types
v1: diameter 0.45, hole 0.299, Top Layer to Bottom Layer, 705 vias
v2: diameter 0.508, hole 0.381, Top Layer to Bottom Layer, 1 via

## Routing (per net, layer and track width the routed paths; a pad name or vN(x,y) marks a point on that pad's centre or on a via; arc(x,y) is an arc through that point)
1V8_HDMI: length 40.2
  Top Layer w0.152: 54.08,31.27 54.56,31.75 55.7,31.75 R234.2 ; C130.1 57.7,31.68 v1(57.41,31.68)
  Top Layer w0.254: R234.2 57.01,31.27 57.02,31.28 57.02,31.28 57.32,31.57 57.32,31.59 v1(57.41,31.68)
  Top Layer w0.305: 53.75,32.8 52.3,32.8 U97.6
  Top Layer w0.381: 53.75,32.8 55.83,32.8 C149.2 56.19,32.6 R234.2 56.19,30.81 55.59,30.22 C332.1
  Inner3 w0.508: v1(52.42,22.24) 52.45,22.2 v1(53.63,22.2) 54.12,22.2 arc(54.29,22.47) 54.57,22.62 55.04,23.09 56.64,23.09 57.5,22.23 v1(58.67,22.23)
  Inner4 w0.254: 52.15,29.34 52.1,29.39 v1(52.1,30.02) ; v1(49.95,28.09) 50.8,28.09
  Inner4 w0.508: v1(52.42,22.24) 51.23,23.42 51.23,27.66 50.82,28.07 50.82,28.73 51.43,29.34 52.74,29.34 52.87,29.47 54.16,29.47 v1(54.82,30.13)
  Bottom Layer w0.203: U98.16 52.42,22.24 v1(52.42,22.24) ; v1(54.82,30.13) 54.82,30.13 U98.42 ; v1(53.63,22.2) 53.62,22.21 U98.13 ; v1(52.1,30.02) 52.1,30.04 52.42,30.37 U98.36 ; v1(58.67,22.23) 58.42,22.48 U98.1 ; v1(57.41,31.68) 57.22,31.49 U98.48 ; U98.27 50.8,27.3 50.01,28.09 v1(49.95,28.09) ; U98.2 58.02,22.29 v1(58.06,22.25)
3V3_HDMI_MUX: length 40.6
  Top Layer w0.152: 50.43,38.84 51.18,39.59 51.18,40.82 C522.1
  Top Layer w0.203: 50.82,29.26 50.88,29.26 51.97,28.17 ; 53.01,28.25 53.14,28.25 ; v1(52.09,27.84) 52.09,28.05 C146.1 C145.1
  Top Layer w0.305: U152.6 51.87,38.74 51.76,38.63
  Inner3 w0.254: v1(51.29,38.41) 51.29,32.52 50.35,31.58 v1(43.08,31.58)
  Inner4 w0.381: v1(51.29,38.41) 51.29,36.83 53.07,35.04 53.07,33.63 54.22,32.48 54.22,31.69 55.44,30.47 55.44,28.8 54.76,28.12 52.37,28.12 v1(52.09,27.84)
  Bottom Layer w0.152: v1(43.08,31.58) 43.08,30.7 R130.1 R240.1 43.74,29.03
  Bottom Layer w0.203: v1(52.09,27.84) 51.95,27.7 U98.28
3V3_HUB: length 105.2
  Top Layer w0.152: 40.03,36.75 40.34,36.44 R289.1 C107.1
  Top Layer w0.305: 38.33,36.68 38.23,36.77 U10.6
  Top Layer w0.381: C557.1 36.62,26.24 36.15,26.71 36.15,26.73 35.79,27.09 35.78,27.09 v1(33.68,29.19) ; C557.1 C558.1 ; C557.1 37.48,25.83 v1(38.13,25.17)
  Top Layer w0.508: 38.48,36.75 L6.2 41.71,36.75 41.93,36.53
  Inner3 w0.254: v1(63.73,16.76) 62.98,17.52 62.98,19.12 v1(64.51,20.65) 65.13,20.65 65.73,21.25 65.73,22.65 66.66,23.57 68.86,23.57 69.36,23.07 70.13,23.07 70.63,23.57 71.51,23.57 72.9,24.97 v1(74.36,24.97)
  Inner3 w0.381: v1(65.09,16.79) 65.09,16.15 64.41,15.47 63.47,15.47 61.21,17.73 61.21,23.34 60.1,24.46 51.18,24.46 47.24,20.52 47.24,18.85 46.66,18.26 45.44,18.26 44.83,18.87 44.83,20.62 46.71,22.51 46.71,25.43 45.67,26.47 42.67,26.47 41.53,27.61 v1(41.53,29.12)
  Inner3 w0.762: v1(41.53,29.12) v1(41.53,29.72) 40.49,30.76 35.25,30.76 v1(33.68,29.19)
  Inner4 w0.762: 41.51,29.74 41.51,36.99 v1(41.53,37.01) ; v1(41.53,29.72) v1(41.53,29.12)
  Bottom Layer w0.254: R25.1 65.5,16.76 v1(63.73,16.76) ; v1(64.51,20.65) 65.62,20.65 65.68,20.71 66.31,20.71 C422.1 67.45,20.77 U92.22 ; 33.68,29.14 33.68,29.06 U157.19 ; v1(33.68,29.19) 33.65,29.19 C562.1 ; v1(38.13,25.17) 38.12,25.17 U157.5
  Bottom Layer w0.381: 33.68,29.14 33.68,29.14 v1(33.68,29.19)
  vias: v1(41.94,36.53)
3V3_NAT: length 130.5
  Top Layer w0.152: R88.1 v1(63.61,37.59) R86.1 62.66,37.59 62.48,37.77 62.48,39.75 63.65,40.92 63.65,41.78 62.99,42.44 62.99,46.71 62.08,47.63 57.3,47.63 56.51,46.84 v1(55.6,46.84)
  Top Layer w0.254: U4.6 46.21,17.1 45.75,17.56 C30.1 45.67,18.02 v1(45.67,19.02) ; U158.1 v1(71.32,24.58) ; U158.10 66.69,22.33 C542.2 C543.2 C541.2 ; 66.74,21.18 67.39,21.83 U158.11 ; C564.2 72.02,19.32 72.43,18.91 v1(72.43,17.52)
  Top Layer w0.305: U158.18 70.95,19.64 C564.2 ; 68.45,19.32 68.45,19.32 U158.13
  Top Layer w0.381: v1(63.48,18.36) 63.48,18.7 64.08,19.3 65.65,19.3 66.14,19.8 66.14,19.8 C541.2 66.9,20.19 67.79,19.3 68.31,19.3
  Top Layer w0.5: 46.06,16.72 43.06,16.72 L1.2
  Inner3 w0.381: v1(63.48,18.36) 63.48,18.08 64.01,17.55 ; v1(72.43,17.52) 72.14,17.81 67.17,17.81 66.91,17.55 64.01,17.55 ; 64.01,17.55 64.43,17.13 64.43,16.27 64.16,16 63.62,16 62.56,17.07 62.56,19.45 63.5,20.39 63.5,24.44 62.01,25.92 52.83,25.92 51.95,25.05 51.08,25.05 45.67,19.64 v1(45.67,19.02)
  Inner3 w0.508: v1(71.32,24.58) 71.18,24.44 63.5,24.44
  Inner4 w0.152: v1(63.48,18.36) 63.48,18.39 65.18,20.09 65.18,22.45 59.33,28.3 56.79,28.3 55.85,29.24 55.85,30.58 55.19,31.24 55.19,33.78 52.65,36.32 52.65,36.98 53.44,37.77 53.44,38.96 54.89,40.41 54.89,43.18 54.41,43.66 54.41,44.04 55.6,45.24 v1(55.6,46.84)
  Bottom Layer w0.254: C540.2 71.88,24.58 v1(71.32,24.58)
3V3_WIFI_TFT_CH347: length 177.5
  Top Layer w0.152: R396.1 R388.1 19.33,33.28 19.33,32.54 19.15,32.36 17.45,32.36 17.07,32.74 17.07,34.54 16.53,35.08 U3.22 ; v1(3.81,30.79) 3.76,30.73 2.51,30.73 2.27,30.98 R455.1 C518.1
  Top Layer w0.254: v1(41.05,23.52) 41.03,23.54 FPC1.6 ; v1(37.49,20.73) 37.49,20.85 37.19,21.16 36.82,21.16 36.52,20.85 U156.17 ; FPC1.12 42.59,26.54 43.51,27.46 v1(43.51,28)
  Top Layer w0.381: 47.78,34.1 47.78,33.33 47.42,32.97 46.25,32.97 45.88,33.34 U108.6 45.51,34.47 45.24,34.47 44.45,35.25 L4.2
  Top Layer w0.508: C39.2 13.23,23.45 C40.2 13.33,24.88 U3.9 13.33,26.27 12.9,26.7 10.87,26.7 10.43,27.14 10.43,33.14 12.32,35.02 v1(14.92,35.02) v1(15.63,35.02) 16.28,35.02 U3.22
  Inner3 w0.381: 33.73,33.12 32.71,34.14 32.71,35.03 33.5,35.81 38.43,35.81 38.81,35.43 38.81,34.77 38.43,34.39 38.43,33.89 39.19,33.12 40.57,33.12 v1(42.55,35.11) 42.55,37.51 43.68,38.63 48.84,38.63 50.37,40.16 52.25,40.16 52.68,39.73 54.79,39.73 55.29,40.23 55.29,42.88 54.87,43.3 v1(54.87,43.84)
  Inner3 w0.508: v1(43.51,28) 43.87,28.36 43.87,29.24 41.6,31.5 38.76,31.5 37.54,32.72 34.21,32.72 v1(33.78,33.15)
  Inner4 w0.152: v1(63.73,50.57) 63.04,49.89 60.91,49.89 v1(54.87,43.84)
  Inner4 w0.508: v1(3.81,30.79) v1(3.81,31.43) 4.96,31.43 9.91,36.37 11.28,36.37 12.63,35.02 v1(14.92,35.02) v1(15.63,35.02) 17.79,32.87 20.34,32.87 20.94,32.27 20.94,30.54 21.64,29.85 23.93,29.85 25.3,31.22 27.33,31.22 27.69,31.58 27.69,33.76 28.27,34.34 31.8,34.34 32.99,33.15 v1(33.78,33.15) ; v1(37.49,20.73) 38.25,20.73 v1(41.05,23.52) 41.1,23.57 42.77,23.57 44.02,22.33 45.92,22.33 46.53,22.94 46.53,25.4 45.8,26.14 44.22,26.14 43.51,26.85 v1(43.51,28)
  Bottom Layer w0.152: v1(17.26,36.03) 17.16,36.03 16.94,36.26 ; R32.1 R389.1 R390.1 R391.1 15.04,34.91 v1(14.92,35.02)
  Bottom Layer w0.254: v1(54.87,43.84) 54.87,44.31 54.9,44.34 U74.14 ; v1(14.92,35.02) 14.92,35.56 C525.2
  Bottom Layer w0.381: 16.94,36.26 16.94,35.76 16.48,35.31 15.91,35.31 v1(15.63,35.02)
  Bottom Layer w0.508: v1(14.92,35.02) v1(15.63,35.02)
5V-20V: length 79.9
  Top Layer w0.152: C169.1 82.29,36.58 R324.2 82.8,35.18 84.46,35.18 v1(84.64,35.36) ; M2.2 v1(84.13,30.79) ; M2.1 83.48,30.78 v1(83.49,30.79) ; M2.3 v1(84.78,30.79)
  Top Layer w0.254: R323.1 83.84,15.34 C168.2 83.99,16.27 v1(84.85,17.12)
  Inner3 w0.152: v1(84.85,17.12) 85.32,17.6 85.32,20.89 v1(85.18,21.03)
  Inner3 w0.254: v1(84.64,35.36) 85.01,34.98 85.01,31.02 v1(84.78,30.79)
  Inner4 w0.762: v1(85.17,26.49) v1(84.36,26.49) 77.29,26.49 74.39,29.39 64.16,29.39 62,31.55 v1(62,32.43) v1(62,33.29)
  Bottom Layer w0.254: 36.5,44.02 36.5,44.02 v1(36.5,44.63)
  Bottom Layer w0.762: 34.07,45.7 34.07,45.13 35.18,44.02 50.11,44.02 52.25,41.89 52.25,39.75 57.07,34.93 61.01,34.93 62,33.94 v1(62,33.29) v1(62,32.43) v1(62,31.7)
  vias: v1(33.18,46.2) v1(33.18,45.52) v1(83.88,21.03) v1(84.53,21.03)
+0.9V_DP: length 30.3
  Top Layer w0.203: C164.1 58.01,27.84 v1(58.35,27.84)
  Inner3 w0.254: v1(49.35,21.67) 49.35,21.92 49.74,22.31 50.85,22.31 51.1,22.05 51.1,21.36
  Inner3 w0.381: 51.1,21.36 51.1,21.34 52.18,20.26 58.58,20.26 v1(59.94,21.62)
  Inner4 w0.381: v1(59.94,21.62) 59.94,22.13 58.35,23.72 v1(58.35,27.84)
  Bottom Layer w0.203: v1(49.35,21.67) 49.35,23.44 50.41,24.5 U98.20 ; U98.58 58.61,27.7 58.47,27.84 v1(58.35,27.84) ; 60.73,23.5 60.73,24.49 60.72,24.5 U98.66
  Bottom Layer w0.254: v1(59.94,21.62) 59.94,22.22 60.73,23.01 60.73,23.5
